# EasyEDA Pro project trumpx-ipadrescreen-ipad34-c6ab9950.epro, board PCB_A
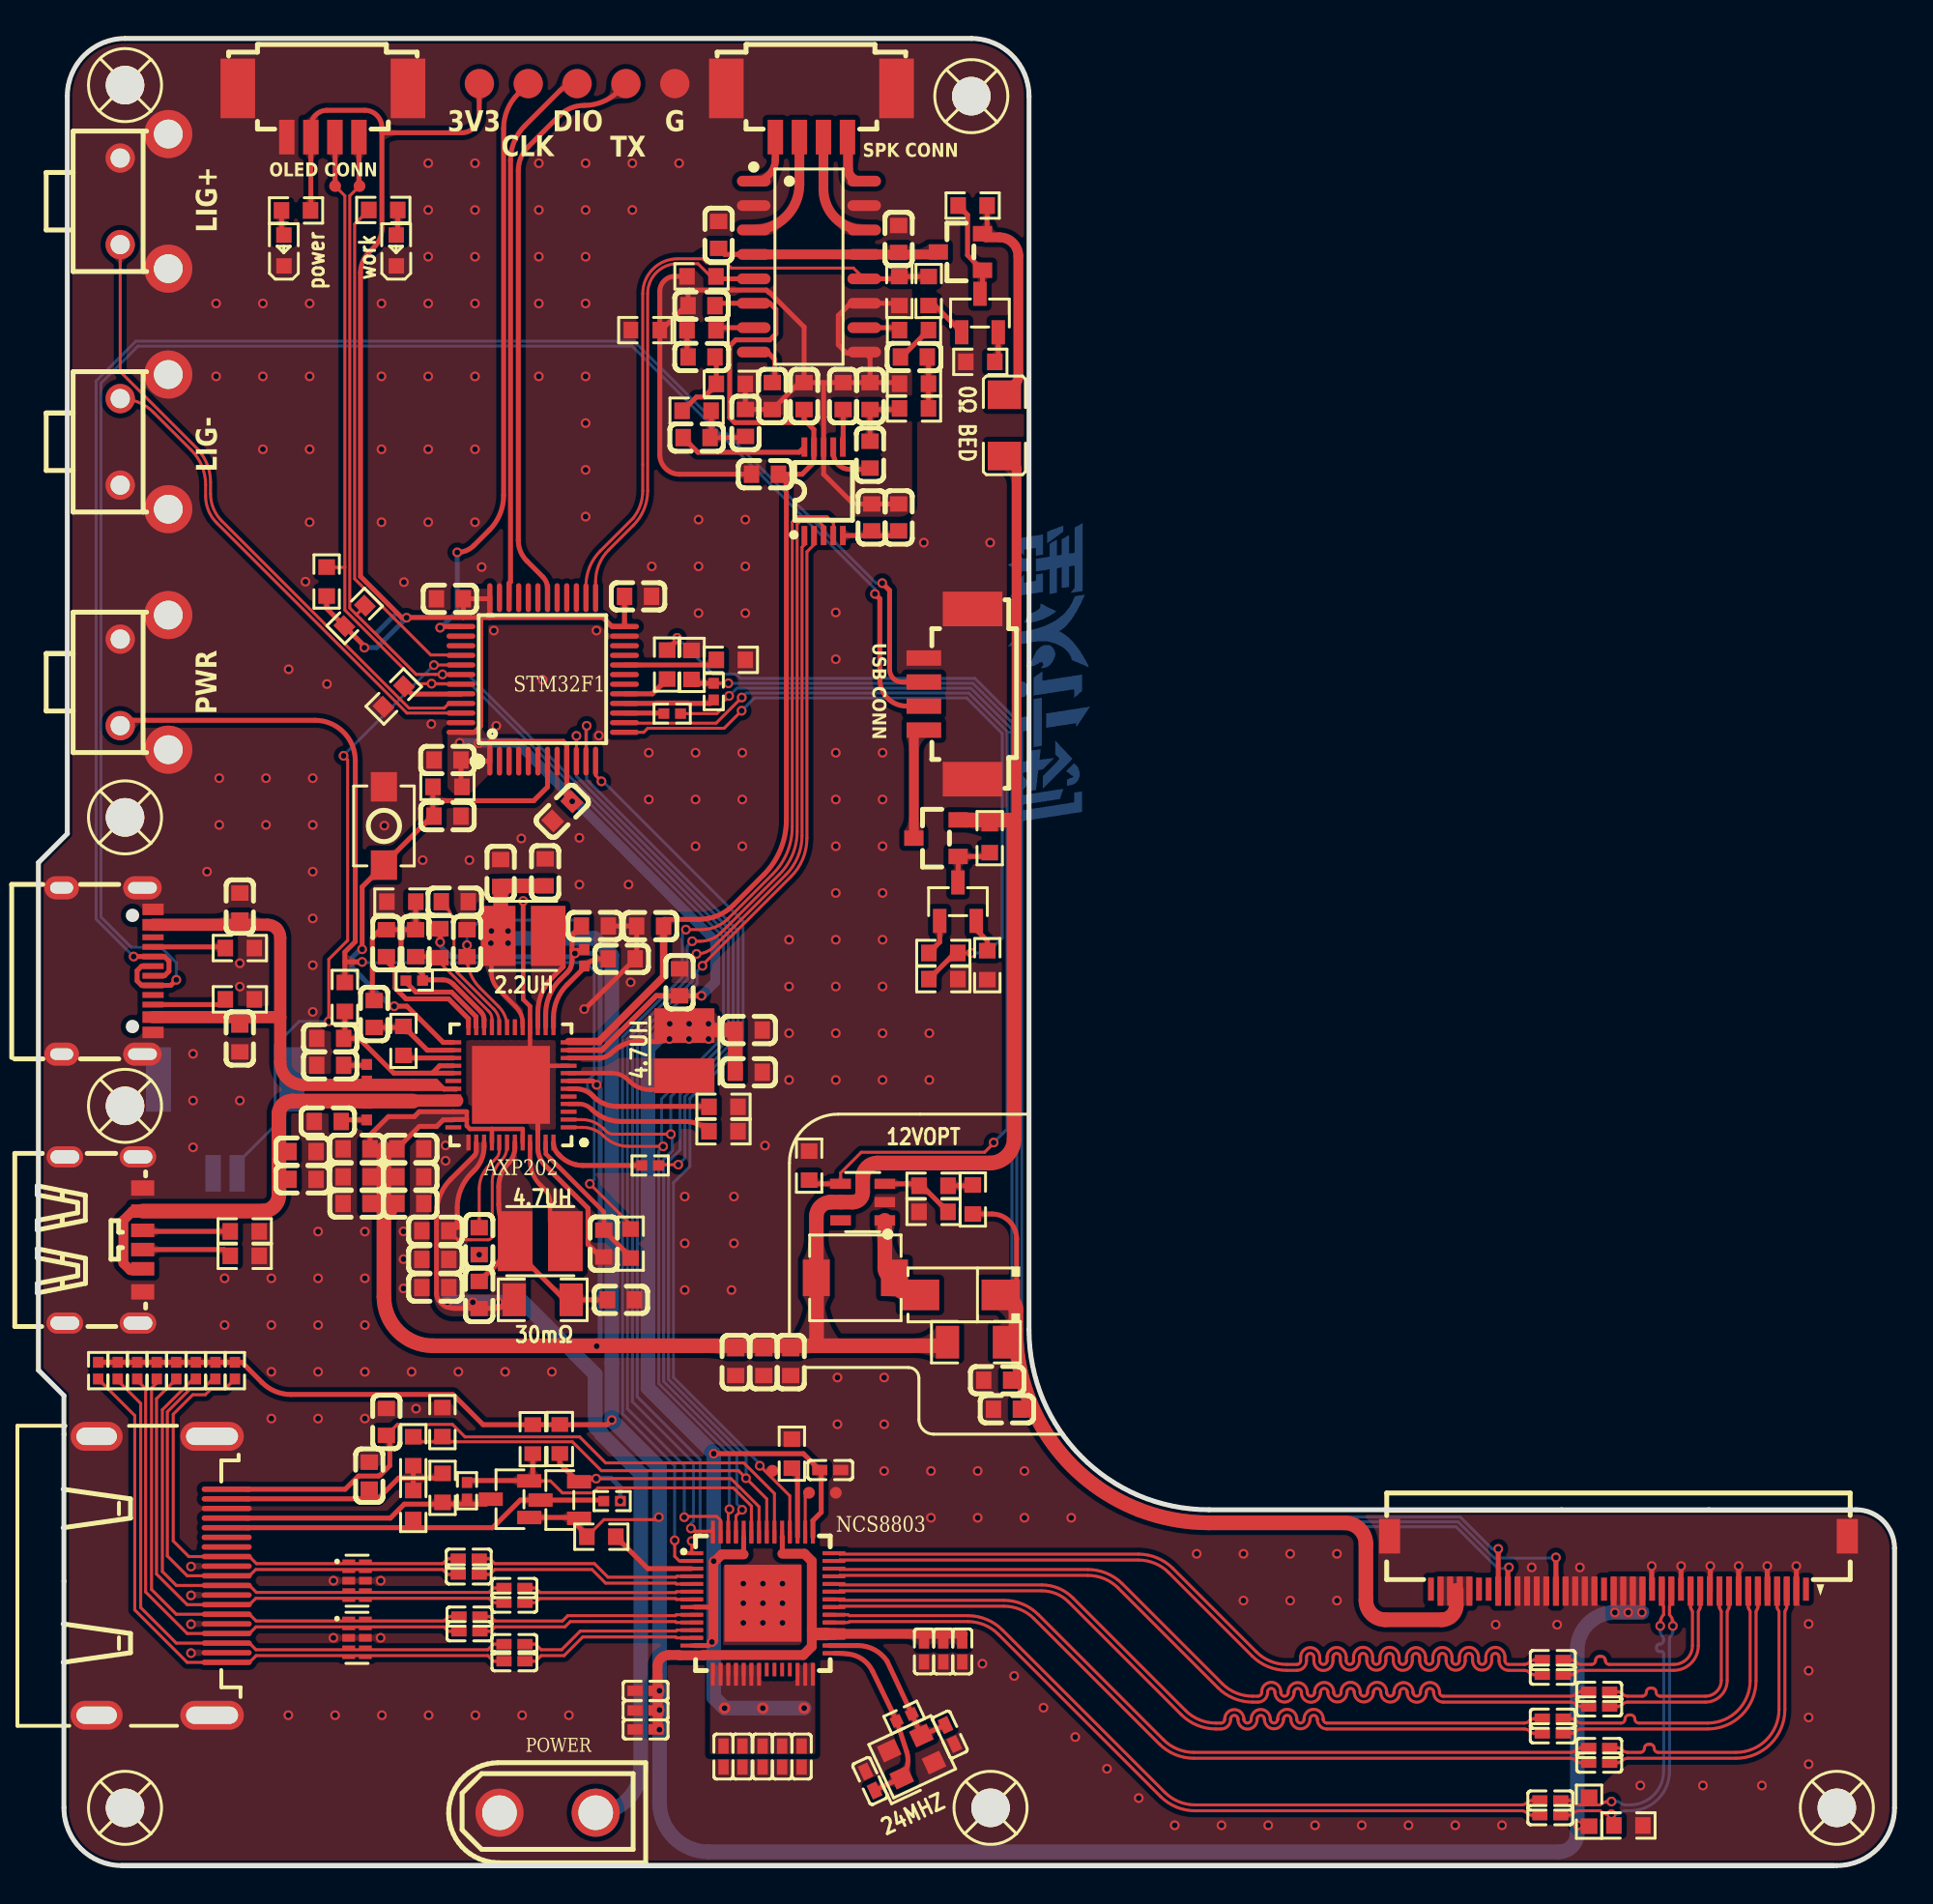
[diagram p6: board, top side]
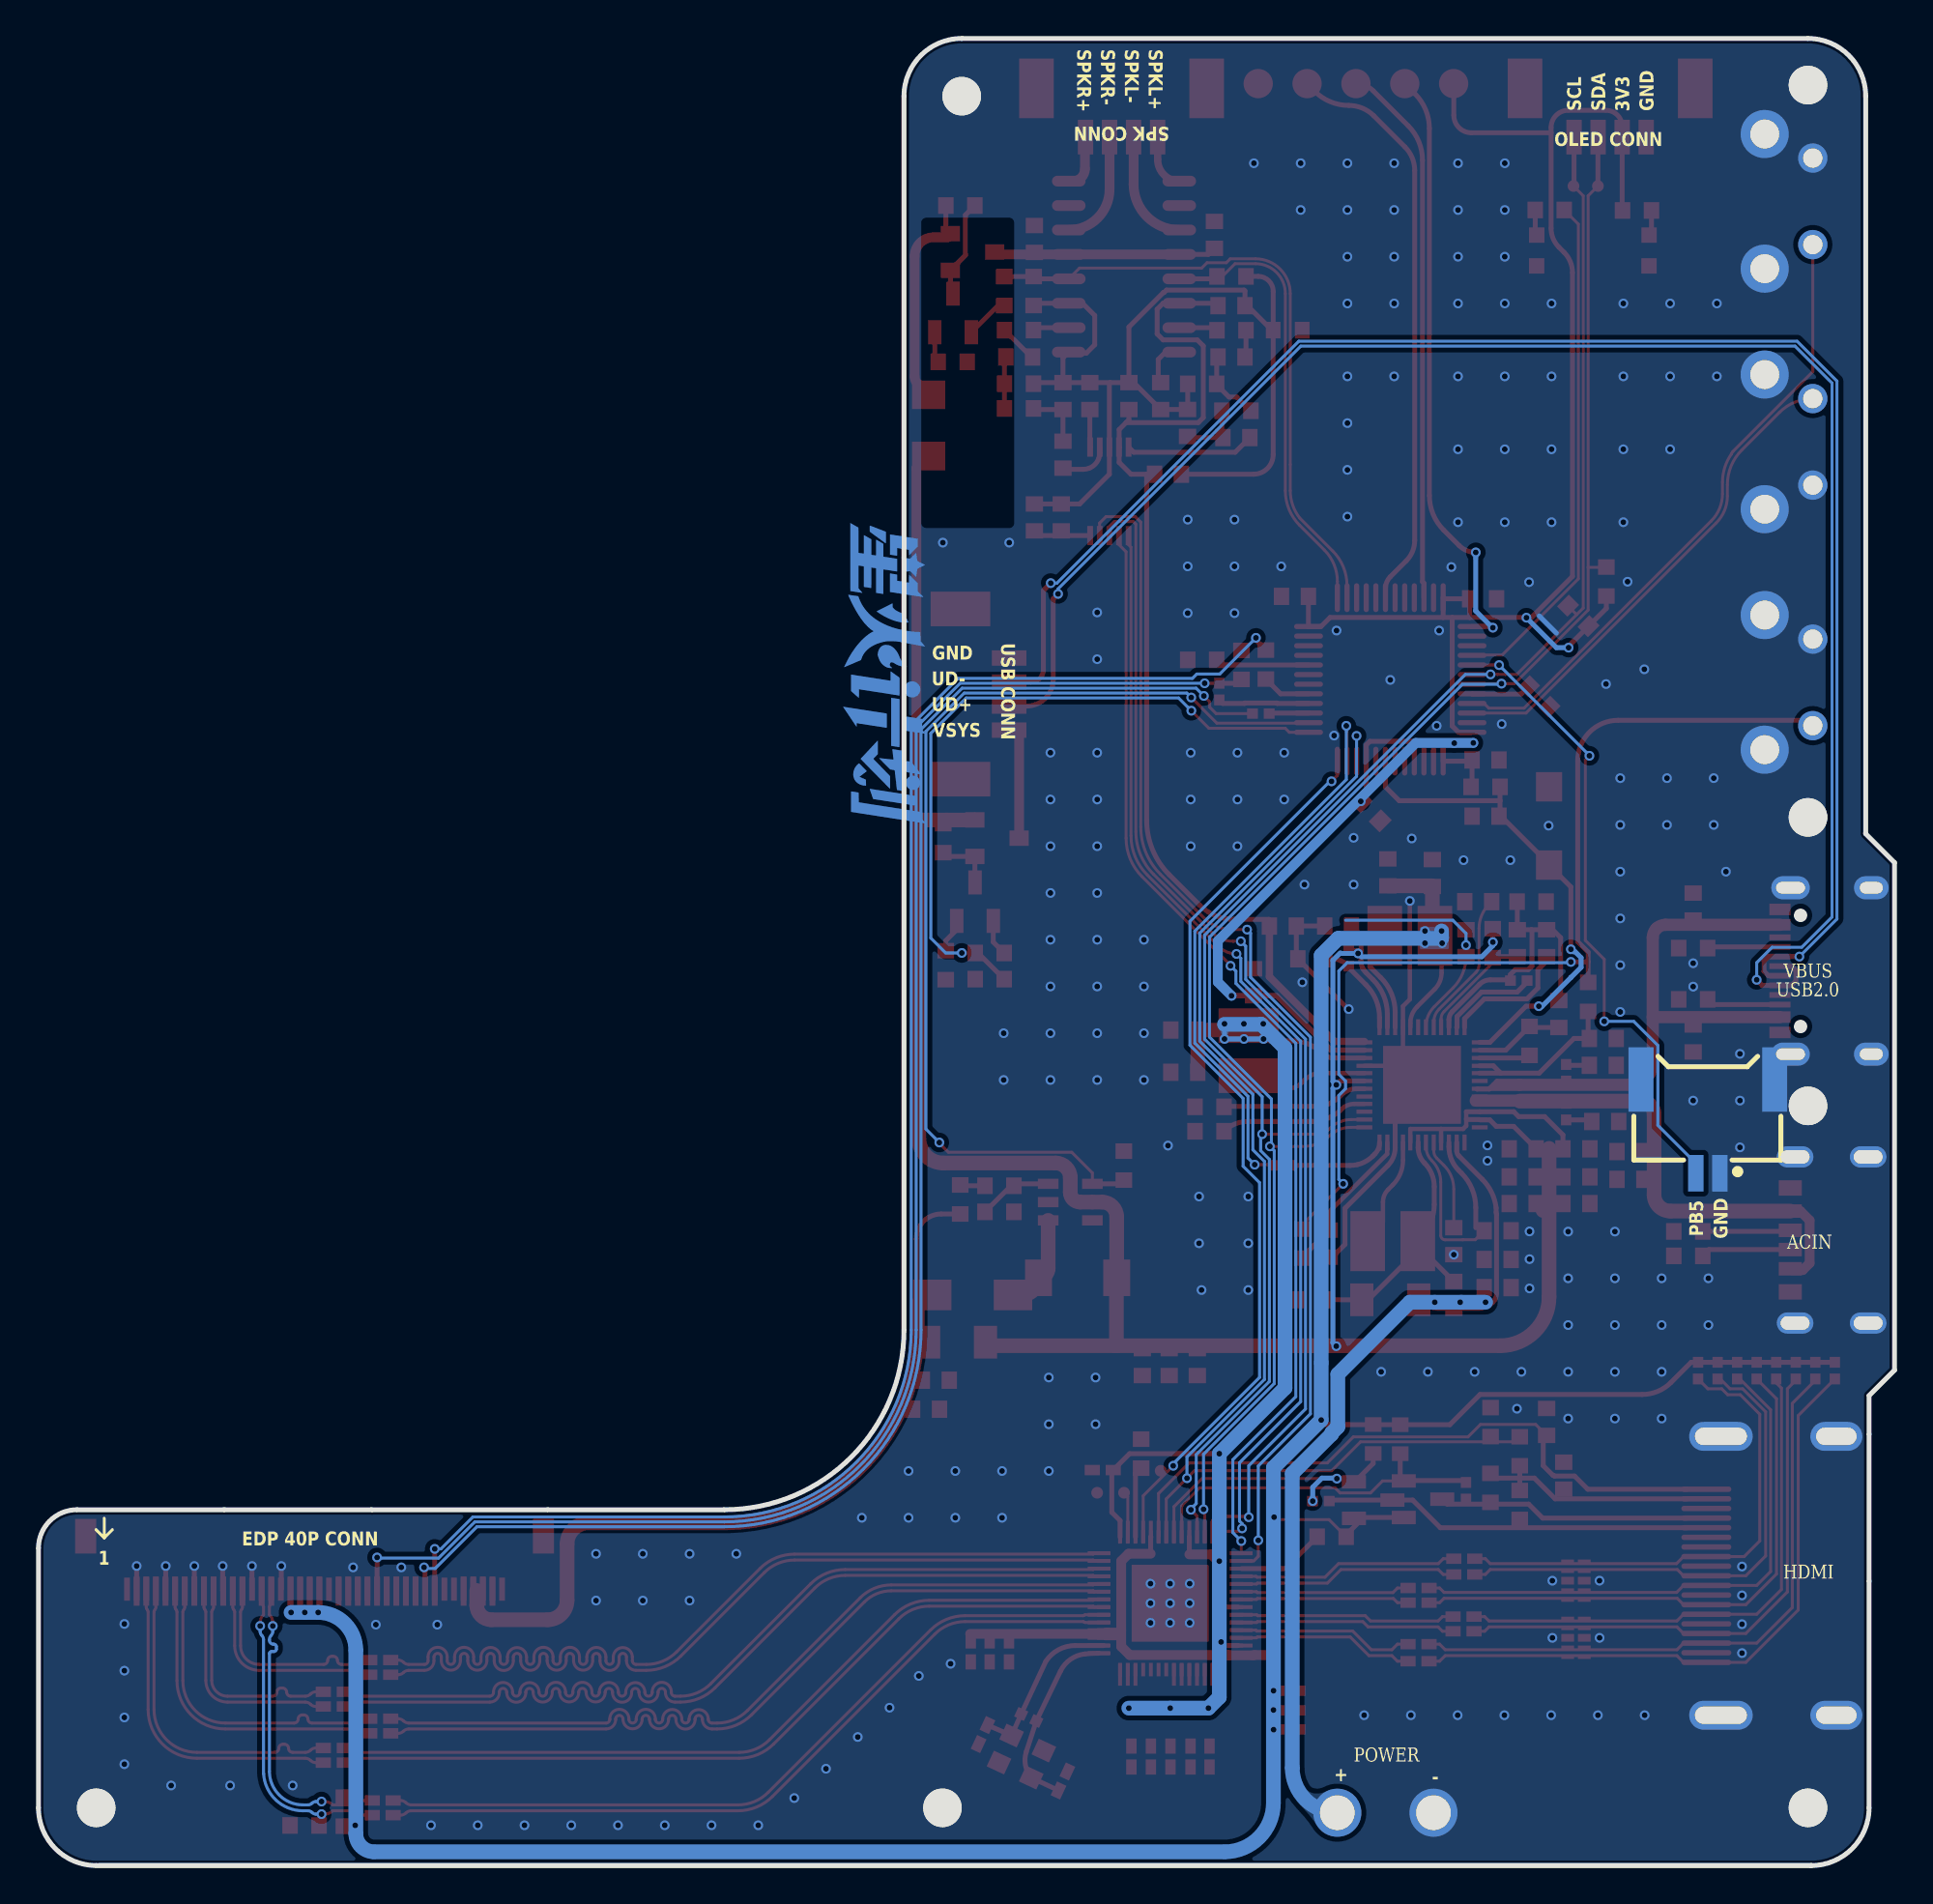
[diagram p7: board, bottom side, seen from below]

Outline 96.5 x 95 mm; copper layers: Top Layer, Inner1, Inner2, Bottom Layer. Coordinates in mm from the lower left corner of the outline.
Outline path: 4.32,0 arc(2.2,0.88) 1.32,3 1.32,24.43 0,25.76 0,52.15 1.5,53.65 1.5,92 arc(2.38,94.12) 4.5,95 48.5,95 arc(50.62,94.12) 51.5,92 51.5,27.85 arc(54.24,21.24) 60.85,18.5 94.5,18.5 arc(95.91,17.91) 96.5,16.5 96.5,3 arc(95.62,0.88) 93.5,0 4.32,0 ; 4.32,0 93.33,0 ; 79.18,18.49 arc(79.18,18.5) 79.18,18.5
Stack: Top Layer 0.035mm 外层铜厚1oz / Dielectric1 0.2104mm 7628 RC49% 8.6mil / Inner1 0.0152mm 内层铜厚 / Dielectric2 1.065mm 1.1mm H/HOZ Copper / Inner2 0.0152mm 内层铜厚 / Dielectric3 0.2104mm 7628 RC49% 8.6mil / Bottom Layer 0.035mm 外层铜厚1oz

## Design rules (mm)
net TMDS_CK_N: DP4
net HSICN: DP5
net TMDS_CK_P: DP4
net HSICP: DP5
net TMDS_D0_N: DP3
net HSI0N: DP6
net TMDS_D0_P: DP3
net HSI0P: DP6
net TMDS_D1_N: DP1
net HSI1N: DP7
net TMDS_D1_P: DP1
net HSI1P: DP7
net TMDS_D2_N: DP2
net HSI2N: DP8
net TMDS_D2_P: DP2
net HSI2P: DP8
net DPOAUX_N: DP13
net DP_AUX_N: DP19
net DPOAUX_P: DP13
net DP_AUX_P: DP19
net DPO0_N: DP9
net DP_LANE0_N: DP15
net DPO0_P: DP9
net DP_LANE0_P: DP15
net DPO1_N: DP10
net DP_LANE1_N: DP16
net DPO1_P: DP10
net DP_LANE1_P: DP16
net DPO2_N: DP11
net DP_LANE2_N: DP17
net DPO2_P: DP11
net DP_LANE2_P: DP17
net DPO3_N: DP12
net DP_LANE3_N: DP18
net DPO3_P: DP12
net DP_LANE3_P: DP18
net HDMI_DDC_SCL: DP14
net HDMI_DDC_SDA: DP14
spacing copperThickness1oz (default): track to track 0.102, other pairs 0.152 to 0.3
spacing copperThickness2oz: track to track 0.203, other pairs 0.152 to 0.3
spacing Plane_innerPlane: track to track 0.102, other pairs 0.152 to 0.3
spacing Copper_copperRegion: track to track 0.102, other pairs 0.152 to 0.3
track width copperThickness1oz (default): min 0.127, default 0.254, max 2.54
track width copperThickness2oz: min 0.203, default 0.254, max 2.54
differential pair differentialPair (default): width min 0.127, default 0.254, max 2.54; gap min 0.152, default 0.152
pour e2129 uses Copper_copperRegion
pour e2131 uses Copper_copperRegion
pour e2146 uses Copper_copperRegion
pour e2148 uses Copper_copperRegion
pour e2150 uses Copper_copperRegion
pour e2152 uses Copper_copperRegion
pour e2154 uses Copper_copperRegion
pour e2156 uses Copper_copperRegion
pour e2158 uses Copper_copperRegion
pour e2160 uses Copper_copperRegion
pour e2162 uses Copper_copperRegion
pour e2164 uses Copper_copperRegion
pour e2167 uses Copper_copperRegion
pour e2169 uses Copper_copperRegion
pour e2171 uses Copper_copperRegion
pour e2173 uses Copper_copperRegion
pour e2175 uses Copper_copperRegion
pour e2177 uses Copper_copperRegion
pour e2182 uses Copper_copperRegion
pour e2184 uses Copper_copperRegion

## Placement (name value [footprint] x y rotation side)
BEAD1  CBM321609U000T  [L1206]  50.22 74.88 270 top
C1  100nF  [C0402]  78.6 3.38 180 top
C2  100nF  [C0402]  22.37 15.95 180 top
C3  100nF  [C0402]  78.6 2.62 180 top
C4  100nF  [C0402]  22.37 15.14 180 top
C5  100nF  [C0402]  24.75 14.43 180 top
C6  100nF  [C0402]  24.75 13.67 180 top
C7  100nF  [C0402]  78.73 9.92 180 top
C8  100nF  [C0402]  22.41 12.94 180 top
C9  100nF  [C0402]  78.73 10.68 180 top
C10  100nF  [C0402]  22.41 12.18 180 top
C11  100nF  [C0402]  81.14 8.27 180 top
C12  100nF  [C0402]  24.75 11.51 180 top
C13  100nF  [C0402]  81.14 9.03 180 top
C14  100nF  [C0402]  24.75 10.62 180 top
C15  100nF  [C0402]  78.73 6.87 180 top
C16  1uF  [C0603]  17.2 20.27 90 top
C17  100nF  [C0402]  78.73 7.64 180 top
C18  1uF  [C0603]  18.09 23.07 270 top
C19  100nF  [C0402]  81.14 5.35 180 top
C20  100nF  [C0402]  81.14 6.11 180 top
C21  18PF  [C0402_NEW]  43.23 4.4 115 top
C22  18PF  [C0402_NEW]  47.39 6.81 295 top
C23  100nF  [C0402]  37.65 5.67 270 top
C24  10nF  [C0402]  36.6 5.67 270 top
C25  100nF  [C0402]  41.17 20.56 0 top
C26  10nF  [C0402]  39.68 5.67 270 top
C27  100nF  [C0402]  31.56 7.08 180 top
C28  10nF  [C0402]  47.05 11.13 270 top
C29  100nF  [C0603]  27.23 54.82 45 top
C30  100nF  [C0603]  21.26 57.48 0 top
C31  100nF  [C0603]  21.39 65.87 0 top
C32  100nF  [C0603]  31.17 65.99 180 top
C33  100nF  [C0402]  38.66 5.67 270 top
C34  10nF  [C0402]  35.61 5.67 270 top
C35  100nF  [C0402]  31.56 9.08 180 top
C36  10nF  [C0402]  31.56 8.07 180 top
C37  100nF  [C0402]  48.03 11.13 270 top
C38  10nF  [C0402]  46.04 11.13 270 top
C39  1uF  [C0603]  22.91 29.67 270 top
C40  10uF  [C0603]  20.63 31.51 0 top
C41  10uF  [C0603]  16.54 35.81 0 top
C42  10uF  [C0603]  30.28 29.42 0 top
C43  220nF  [C0603]  19.33 37.26 180 top
C44  10uF  [C0603]  16.54 34.42 180 top
C45  4.7uF  [C0603]  15.04 38.69 0 top
C46  1nF  [C0603]  36.93 43.44 0 top
C47  4.7uF  [C0603]  15.17 41.61 0 top
C48  10uF  [C0603]  36.93 41.25 0 top
C49  10uF  [C0603]  28.93 48.85 0 top
C50  1uF  [C0603]  17.45 44.28 270 top
C51  1nF  [C0603]  24.03 51.61 90 top
C52  10uF  [C0603]  26.34 51.64 90 top
C53  220nF  [C0603]  19.61 47.96 270 top
C54  4.7uF  [C0603]  36.25 26.18 270 top
C55  1uF  [C0603]  18.09 47.96 270 top
C56  4.7uF  [C0603]  16.54 37.26 180 top
C57  10uF  [C0603]  30.32 47.14 0 top
C58  4.7uF  [C0603]  22.28 47.96 270 top
C59  1uF  [C0603]  15.17 43.01 180 top
C60  4.7uF  [C0603]  31.8 48.85 180 top
C61  1uF  [C0603]  21.64 50.12 0 top
C62  4.7uF  [C0603]  22.91 32.46 270 top
C63  1uF  [C0603]  29.39 32.34 90 top
C64  4.7uF  [C0603]  33.33 45.93 90 top
C65  10uF  [C0603]  39.11 26.18 90 top
C66  100nF  [C0603]  37.71 26.18 90 top
C67  100nF  [C0603]  50.35 23.73 0 top
C68  10uF  [C0603]  49.85 25.24 0 top
C69  10uF  [C0603]  20.63 30.05 0 top
C70  100nF  [C0603]  20.63 33.01 0 top
C71  10uF  [C0603]  19.33 34.42 180 top
C72  100nF  [C0603]  19.33 35.81 180 top
C73  10uF  [C0603]  13.73 35.68 180 top
C74  100nF  [C0603]  13.73 37.12 180 top
C75  10uF  [C0603]  10.47 43.01 90 top
C76  100nF  [C0603]  10.47 49.86 270 top
C77  1uF  [C0603]  35.36 84.79 270 top
C78  1uF  [C0603]  44.72 84.57 90 top
C79  1uF  [C0603]  34.47 81.11 180 top
C80  10uF  [C0603]  37.77 72.34 180 top
C81  100nF  [C0603]  39.81 76.41 270 top
C82  3.3nF  [C0603]  43.23 76.41 90 top
C83  470nF  [c0603]  34.47 78.44 180 top
C84  470nF  [c0603]  45.51 78.44 180 top
C85  4.7uF  [C0603]  43.23 73.36 90 top
C86  100nF  [C0603]  38.15 76.41 90 top
C87  4.7uF  [C0603]  34.22 74.25 0 top
C88  10uF  [C0603]  43.32 70.1 270 top
C89  100nF  [C0603]  44.72 70.1 90 top
C90  10uF  [C0603]  41.84 76.41 270 top
C91  3.3nF  [C0603]  36.76 75.01 270 top
C92  100nF  [C0603]  21.26 54.56 180 top
CN1  XT30UPB-M  [CONN-TH_XT30UPB-M]  26.47 2.75 0 top
D1  SS34  [SMA_L4.3-W2.5-LS5.0-RD]  47.93 29.67 180 top
E1  RCLAMP0524P_C907837  [DFN2510-10_L2.5-W1.0-P0.50-BL]  16.56 11.84 270 top
E2  RCLAMP0524P_C907837  [DFN2510-10_L2.5-W1.0-P0.50-BL]  16.56 14.81 270 top
FPC1  X05A15L40T  [FFC-SMD_40P-P0.50_XKB_X05A15L40T]  82.15 15.75 180 top
FPC2  1.25-4PWB  [CONN-SMD_1.25-4PWB]  40.19 91.14 180 top
FPC3  1.25-4PWB  [CONN-SMD_1.25-4PWB]  47.3 60.91 90 top
FPC4  1.25-4PWB  [CONN-SMD_1.25-4PWB]  14.79 91.14 180 top
HDMI1  HDMI-SWM-19  [HDMI-SMD_19P-P0.50-H-F]  6.4 15.06 270 top
L1  4.7uH  [IND-SMD_L3.5-W3.0]  26.09 32.46 0 top
L2  4.7uH  [IND-SMD_L3.5-W3.0]  33.58 42.37 270 top
L3  2.2uH  [IND-SMD_L3.5-W3.0]  25.2 48.34 0 top
L4  22uH  [IND-SMD_L4.6-W4.2_SMMS0420]  42.47 30.56 180 top
LED1  -  [LED_0603]  12.75 84.03 90 top
LED2  -  [LED_0603]  18.6 84.03 90 top
NOREF  -  [Pad_e389]  41.38 15.04 270 top
NOREF#2  -  [Pad_e403]  39.46 9.92 180 top
NOREF#3  -  [Pad_e395]  41.38 12.64 270 top
NOREF#4  -  [Pad_e405]  40.27 9.92 180 top
NOREF#5  -  [Pad_e365]  33.95 12.64 90 top
NOREF#6  -  [Pad_e367]  33.95 11.84 90 top
NOREF#7  -  [Pad_e352]  88.4 14.27 180 top
NOREF#8  -  [Pad_e354]  90.4 14.27 180 top
NOREF#9  -  [Pad_e323]  40.06 19.38 0 top
NOREF#10  -  [Pad_e381]  39.46 17.35 0 top
NOREF#11  -  [Pad_e406]  36.27 9.92 180 top
NOREF#12  -  [Pad_e402]  37.46 9.92 180 top
NOREF#13  -  [Pad_e327]  74.4 14.27 180 top
NOREF#14  -  [Pad_e377]  37.86 17.35 0 top
NOREF#15  -  [Pad_e398]  35.46 9.92 180 top
NOREF#16  -  [Pad_e358]  33.95 15.84 90 top
NOREF#17  -  [Pad_e399]  35.86 9.92 180 top
NOREF#18  -  [Pad_e322]  38.15 20.53 0 top
NOREF#19  -  [Pad_e412]  25.46 92.65 180 top
NOREF#20  -  [Pad_e333]  78.4 14.27 180 top
NOREF#21  -  [Pad_e342]  83.4 14.27 180 top
NOREF#22  -  [Pad_e362]  33.95 14.24 90 top
NOREF#23  -  [Pad_e413]  22.92 92.65 180 top
NOREF#24  -  [Pad_e341]  82.9 14.27 180 top
NOREF#25  -  [Pad_e411]  28 92.65 180 top
NOREF#26  -  [Pad_e373]  36.26 17.35 0 top
NOREF#27  -  [Pad_e383]  33.95 13.44 90 top
NOREF#28  -  [Pad_e345]  85.9 14.27 180 top
NOREF#29  -  [Pad_e386]  41.38 12.24 270 top
NOREF#30  -  [Pad_e336]  79.9 14.27 180 top
NOREF#31  -  [Pad_e387]  41.38 15.84 270 top
NOREF#32  -  [Pad_e401]  37.06 9.92 180 top
NOREF#33  -  [Pad_e407]  40.26 17.35 0 top
NOREF#34  -  [Pad_e400]  36.67 9.92 180 top
NOREF#35  -  [Pad_e331]  77.4 14.27 180 top
NOREF#36  -  [Pad_e409]  33.08 92.65 180 top
NOREF#37  -  [Pad_e355]  90.9 14.27 180 top
NOREF#38  -  [Pad_e376]  37.46 17.35 0 top
NOREF#39  -  [Pad_e380]  39.06 17.35 0 top
NOREF#40  -  [Pad_e370]  41.38 16.24 270 top
NOREF#41  -  [Pad_e332]  77.9 14.27 180 top
NOREF#42  -  [Pad_e347]  87.4 14.27 180 top
NOREF#43  -  [Pad_e348]  87.9 14.27 180 top
NOREF#44  -  [Pad_e410]  30.54 92.65 180 top
NOREF#45  -  [Pad_e391]  41.38 14.24 270 top
NOREF#46  -  [Pad_e320]  15.42 87.33 0 top
NOREF#47  -  [Pad_e349]  88.9 14.27 180 top
NOREF#48  -  [Pad_e357]  33.95 16.24 90 top
NOREF#49  -  [Pad_e408]  33.95 11.04 90 top
NOREF#50  -  [Pad_e325]  73.4 14.27 180 top
NOREF#51  -  [Pad_e339]  81.9 14.27 180 top
NOREF#52  -  [Pad_e343]  84.4 14.27 180 top
NOREF#53  -  [Pad_e363]  33.95 13.84 90 top
NOREF#54  -  [Pad_e319]  41.46 19.38 0 top
NOREF#55  -  [Pad_e324]  72.9 14.27 180 top
NOREF#56  -  [Pad_e344]  84.9 14.27 180 top
NOREF#57  -  [Pad_e356]  91.4 14.27 180 top
NOREF#58  -  [Pad_e369]  35.06 9.92 180 top
NOREF#59  -  [Pad_e384]  33.95 11.44 90 top
NOREF#60  -  [Pad_e364]  33.95 13.04 90 top
NOREF#61  -  [Pad_e326]  73.9 14.27 180 top
NOREF#62  -  [Pad_e374]  36.66 17.35 0 top
NOREF#63  -  [Pad_e371]  35.46 17.35 0 top
NOREF#64  -  [Pad_e346]  86.4 14.27 180 top
NOREF#65  -  [Pad_e396]  41.38 11.44 270 top
NOREF#66  -  [Pad_e388]  41.38 15.44 270 top
NOREF#67  -  [Pad_e382]  39.86 17.35 0 top
NOREF#68  -  [Pad_e392]  41.38 13.84 270 top
NOREF#69  -  [Pad_e330]  76.9 14.27 180 top
NOREF#70  -  [Pad_e375]  37.06 17.35 0 top
NOREF#71  -  [Pad_e368]  35.06 17.35 0 top
NOREF#72  -  [Pad_e397]  41.38 11.04 270 top
NOREF#73  -  [Pad_e334]  78.9 14.27 180 top
NOREF#74  -  [Pad_e366]  33.95 12.24 90 top
NOREF#75  -  [Pad_e404]  39.86 9.92 180 top
NOREF#76  -  [Pad_e372]  35.86 17.35 0 top
NOREF#77  -  [Pad_e351]  89.9 14.27 180 top
NOREF#78  -  [Pad_e329]  76.4 14.27 180 top
NOREF#79  -  [Pad_e361]  33.95 14.64 90 top
NOREF#80  -  [Pad_e394]  41.38 13.04 270 top
NOREF#81  -  [Pad_e390]  41.38 14.64 270 top
NOREF#82  -  [Pad_e321]  16.69 87.33 0 top
NOREF#83  -  [Pad_e359]  33.95 15.44 90 top
NOREF#84  -  [Pad_e350]  89.4 14.27 180 top
NOREF#85  -  [Pad_e337]  80.4 14.27 180 top
NOREF#86  -  [Pad_e335]  79.4 14.27 180 top
NOREF#87  -  [Pad_e340]  82.4 14.27 180 top
NOREF#88  -  [Pad_e385]  41.38 11.84 270 top
NOREF#89  -  [Pad_e328]  75.9 14.27 180 top
NOREF#90  -  [Pad_e360]  33.95 15.04 90 top
NOREF#91  -  [Pad_e393]  41.38 13.44 270 top
NOREF#92  -  [Pad_e353]  86.9 14.27 180 top
NOREF#93  -  [Pad_e378]  38.26 17.35 0 top
NOREF#94  -  [Pad_e379]  38.66 17.35 0 top
NOREF#95  -  [Pad_e338]  80.9 14.27 180 top
Q1  2N7002  [SOT-23-3_L2.9-W1.3-P1.90-LS2.4-BR]  27.11 19 0 top
Q2  2N7002  [SOT-23-3_L2.9-W1.3-P1.90-LS2.4-BR]  24.52 19.05 0 top
Q3  AO3401A  [SOT-23_L2.9-W1.3-P1.90-LS2.4-BR]  47.93 83.9 0 top
Q4  SS8050  [SOT-23-3_L2.9-W1.3-P1.90-LS2.4-BR]  48.95 80.72 270 top
Q5  AO3401A  [SOT-23_L2.9-W1.3-P1.90-LS2.4-BR]  46.66 53.42 0 top
Q6  SS8050  [SOT-23-3_L2.9-W1.3-P1.90-LS2.4-BR]  47.81 50.12 270 top
R1  100kΩ  [R0603]  80.62 2.8 90 top
R3  4.7kΩ  [R0603]  39.17 21.41 90 top
R4  49.9Ω  [R0402]  3.1 25.73 90 top
R6  49.9Ω  [R0402]  4.12 25.73 90 top
R7  49.9Ω  [R0402]  5.13 25.73 90 top
R8  100kΩ  [R0603]  82.67 2.08 180 top
R9  49.9Ω  [R0402]  6.15 25.73 90 top
R10  49.9Ω  [R0402]  7.17 25.73 90 top
R11  49.9Ω  [R0402]  8.18 25.73 90 top
R12  49.9Ω  [R0402]  9.2 25.73 90 top
R13  4.7kΩ  [R0603]  29.27 17.1 180 top
R14  49.9Ω  [R0402]  10.21 25.73 90 top
R15  12kΩ  [R0603]  19.49 21.54 90 top
R16  10kΩ  [R0603]  21 23.06 270 top
R17  1M  [R0402]  45.01 7.7 205 top
R18  1kΩ  [R0603]  32.69 62.44 90 top
R19  49.9Ω  [R0402]  32.95 59.9 0 top
R20  49.9Ω  [R0402]  35.11 61.04 90 top
R21  10kΩ  [R0603]  33.96 62.43 270 top
R22  NC  [R0402]  29.82 18.95 0 top
R23  1kΩ  [R0603]  13.39 86.06 180 top
R24  1kΩ  [R0603]  17.93 86.08 0 top
R25  10kΩ  [R0603#2]  27.11 22.18 270 top
R26  10kΩ  [R0603]  19.49 18.75 270 top
R27  10kΩ  [R0603]  36 62.69 0 top
R28  10kΩ  [R0603#2]  18.47 60.79 225 top
R29  NC  [R0402]  22.28 19.49 90 top
R30  10kΩ  [R0603#2]  25.7 22.17 270 top
R31  10kΩ  [R0603]  21.01 19.64 270 top
R32  30mΩ  [R1206]  26.22 29.42 0 top
R33  2.2R  [R0402]  17.07 39.2 270 top
R34  2.2R  [R0402]  17.07 41.23 90 top
R35  200kΩ  [R0402]  19.54 46.01 180 top
R36  0Ω  [R0603]  20.89 47.96 270 top
R37  1R  [R0402]  28.38 47.2 270 top
R38  0Ω  [R0603]  18.87 50.12 0 top
R39  4.7kΩ  [R0603]  15.93 45.16 90 top
R40  1kΩ  [R0603]  30.79 32.34 270 top
R41  10kΩ  [R0603]  18.98 42.88 90 top
R42  0Ω  [R1206]  48.74 27.21 0 top
R43  10kΩ  [R0603]  48.58 34.63 270 top
R44  10kΩ  [R0603]  40.07 36.39 270 top
R45  10kΩ  [R0603]  46.54 35.34 0 top
R46  1kΩ  [R0603]  46.54 33.99 180 top
R47  49.9Ω  [R0402]  31.8 36.4 0 top
R48  10kΩ  [R0603]  35.61 39.45 180 top
R49  4.7kΩ  [R0603]  35.61 38.18 180 top
R52  10kΩ  [R0603]  45.52 77.05 180 top
R53  1kΩ  [R0603]  34.47 79.83 180 top
R54  1kΩ  [R0603]  45.52 79.84 180 top
R55  100kΩ  [R0603]  45.52 75.76 180 top
R56  100kΩ  [R0603]  34.22 75.64 180 top
R57  100kΩ  [R0603]  48.57 86.31 0 top
R58  10kΩ  [R0603]  36 77.04 180 top
R59  10kΩ  [R0603]  46.28 81.87 270 top
R60  10kΩ  [R0603]  34.47 82.63 0 top
R61  10kΩ  [R0603]  44.76 81.87 270 top
R62  1kΩ  [R0603]  48.97 78.18 0 top
R63  0Ω  [R0603#2]  31.55 79.84 180 top
R64  100kΩ  [R0603]  49.46 53.42 90 top
R65  10kΩ  [R0603]  47.05 47.45 180 top
R66  10kΩ  [R0603]  47.05 46.09 0 top
R67  1kΩ  [R0603]  49.33 46.81 90 top
R68  5.1kΩ  [R0603]  10.47 45.04 0 top
R69  10kΩ  [R0603]  21.26 56.09 0 top
R71  5.1kΩ  [R0603]  10.47 47.7 0 top
R72  5.1kΩ  [R0603]  10.72 31.7 0 top
R73  5.1kΩ  [R0603]  10.72 32.97 0 top
R74  4.7kΩ  [R0603#2]  16.44 64.98 45 top
R75  4.7kΩ  [R0603]  14.98 66.76 90 top
SCREW1  -  [M2螺丝]  93.5 3 0 top
SCREW2  -  [M2螺丝]  4.5 3 0 top
SCREW3  -  [M2螺丝]  4.5 39.5 0 top
SCREW4  -  [M2螺丝]  4.5 54.5 0 top
SCREW5  -  [M2螺丝]  48.5 92 0 top
SCREW6  -  [M2螺丝]  4.5 92.58 0 top
SCREW7  -  [M2螺丝]  49.5 3 0 top
SW1  TC-6615-5-260G  [SW-TH_4P-L7.5-W5.0-P4.50]  5.5 86.53 90 top
SW2  TC-6615-5-260G  [SW-TH_4P-L7.5-W5.0-P4.50]  5.5 74.03 90 top
SW3  TC-6615-5-260G  [SW-TH_4P-L7.5-W5.0-P4.50]  5.5 61.52 90 top
SW4  -  [Key_SMD_3x4x2]  17.96 54.05 270 top
U1  NCS8803  [QFN-56_L7.0-W7.0-P0.40-TL-EP5.2]  37.66 13.64 0 top
U2  STM32F103C8T6  [LQFP-48_L7.0-W7.0-P0.50-LS9.0-BL]  26.22 61.67 0 top
U3  -  [AXP202]  24.57 40.59 180 top
U4  MT3608  [SOT-23-6_L2.9-W1.6-P0.95-LS2.8-BL]  42.85 34.5 90 top
U5  PAM8403  [SOP-16_L10.0-W3.9-P1.27-LS6.0-BL]  40.06 83.14 270 top
U6  CS4344-CZZR  [TSSOP-10_L3.0-W3.0-P0.50-LS4.9-BL]  40.82 71.45 0 top
U7  XY-MX1.25-2A71  [CONN-SMD_2P-P1.25_XYECONN_XY-MX1.25-2A71]  9.71 38.43 0 bottom
USB1  TYPE-C 16PIN 2MD(073)  [USB-C-SMD_TYPE-C-6PIN-2MD-073]  3.58 46.52 270 top
USB2  TYPE-C 6P  [TYPE-C-SMD_TYPE-C-6P]  3.39 32.53 270 top
X1  24MHz  [CRYSTAL-SMD_4P-L2.5-W2.0-BL-A]  45.39 5.67 25 top

## Footprints (pads in the part's own frame, mm; a bottom-side part is the same pattern mirrored in y, then rotated)
AXP202
  rect 0.826x0.216 smd: 1(-2.997,2.21) 2(-2.997,1.804) 3(-2.997,1.397) 4(-2.997,0.991) 5(-2.997,0.61) 6(-2.997,0.203) 7(-2.997,-0.203) 8(-2.997,-0.61) 9(-2.997,-0.991) 10(-2.997,-1.397) 11(-2.997,-1.804) 12(-2.997,-2.21) 25(2.997,-2.21) 26(2.997,-1.804) 27(2.997,-1.397) 28(2.997,-0.991) 29(2.997,-0.61) 30(2.997,-0.203) 31(2.997,0.203) 32(2.997,0.61) 33(2.997,0.991) 34(2.997,1.397) 35(2.997,1.804) 36(2.997,2.21)
  rect 0.216x0.826 smd: 13(-2.21,-2.997) 14(-1.804,-2.997) 15(-1.397,-2.997) 16(-0.991,-2.997) 17(-0.61,-2.997) 18(-0.203,-2.997) 19(0.203,-2.997) 20(0.61,-2.997) 21(0.991,-2.997) 22(1.397,-2.997) 23(1.804,-2.997) 24(2.21,-2.997) 37(2.21,2.997) 38(1.804,2.997) 39(1.397,2.997) 40(0.991,2.997) 41(0.61,2.997) 42(0.203,2.997) 43(-0.203,2.997) 44(-0.61,2.997) 45(-0.991,2.997) 46(-1.397,2.997) 47(-1.804,2.997) 48(-2.21,2.997)
  rect 4.05x4.05 smd: 49(0,0)
C0402
  rect 0.79x0.54 smd: 1(-0.545,0) 2(0.545,0)
C0402_NEW
  rect 0.79x0.54 smd: 1(-0.545,0) 2(0.545,0)
C0603
  rect 0.8x0.9 smd: 1(-0.7,0) 2(0.7,0)
c0603
  rect 0.8x0.9 smd: 1(-0.7,0) 2(0.7,0)
CONN-SMD_1.25-4PWB
  rect 0.8x1.8 smd: 1(-1.875,1.266) 2(-0.625,1.266) 3(0.625,1.266) 4(1.875,1.266)
  rect 1.8x3.1 smd: 5(-4.425,-1.266) 6(4.425,-1.266)
CONN-SMD_2P-P1.25_XYECONN_XY-MX1.25-2A71
  rect 0.8x1.9 smd: 1(-0.625,2.438) 2(0.625,2.438)
  rect 1.3x3.35 smd: 3(3.475,-2.438) 4(-3.475,-2.438)
CONN-TH_XT30UPB-M
  round 2.5 hole 1.8: 1(-2.5,0) 2(2.5,0)
CRYSTAL-SMD_4P-L2.5-W2.0-BL-A
  rect 1x0.9 smd: 1(-0.925,-0.775) 2(0.925,-0.775) 3(0.925,0.775) 4(-0.925,0.775)
DFN2510-10_L2.5-W1.0-P0.50-BL
  rect 0.2x0.665 smd: 1(-1,-0.432) 2(-0.5,-0.432) 4(0.5,-0.432) 5(1,-0.432) 6(1,0.432) 7(0.5,0.432) 9(-0.5,0.432) 10(-1,0.433)
  rect 0.4x0.665 smd: 3(0,-0.433) 8(0,0.432)
FFC-SMD_40P-P0.50_XKB_X05A15L40T
  rect 0.3x1.2 smd: 1(-9.75,1.377) 2(-9.25,1.377) 3(-8.75,1.377) 4(-8.25,1.377) 5(-7.75,1.377) 6(-7.25,1.377) 7(-6.75,1.377) 8(-6.25,1.377) 9(-5.75,1.377) 10(-5.25,1.377) 11(-4.75,1.377) 12(-4.25,1.377) 13(-3.75,1.377) 14(-3.25,1.377) 15(-2.75,1.377) 16(-2.25,1.377) 17(-1.75,1.377) 18(-1.25,1.377) 19(-0.75,1.377) 20(-0.25,1.377) 21(0.25,1.377) 22(0.75,1.377) 23(1.25,1.377) 24(1.75,1.377) 25(2.25,1.377) 26(2.75,1.377) 27(3.25,1.377) 28(3.75,1.377) 29(4.25,1.377) 30(4.75,1.377) 31(5.25,1.377) 32(5.75,1.377) 33(6.25,1.377) 34(6.75,1.377) 35(7.25,1.377) 36(7.75,1.377) 37(8.25,1.377) 38(8.75,1.377) 39(9.25,1.377) 40(9.75,1.377)
  rect 1.1x1.8 smd: 41(11.9,-1.377) 42(-11.9,-1.377)
HDMI-SMD_19P-P0.50-H-F
  oval 0.28x2.6 smd: 1(4.501,3.38) 2(4,3.38) 3(3.5,3.38) 4(3,3.38) 5(2.499,3.38) 6(1.999,3.38) 7(1.501,3.38) 8(1.001,3.38) 9(0.5,3.38) 10(0,3.38) 11(-0.5,3.38) 12(-1,3.38) 13(-1.498,3.38) 14(-1.999,3.38) 15(-2.499,3.38) 16(-2.999,3.38) 17(-3.5,3.38) 18(-4,3.38) 19(-4.501,3.38)
  oval 1.5x2.7 hole 0.9x2.1: 20(7.25,-3.38) 21(-7.25,-3.38)
  oval 1.5x3.3 hole 0.9x2.7: 22(7.25,2.62) 23(-7.25,2.62)
IND-SMD_L3.5-W3.0
  rect 1.8x3.12 smd: 1(1.303,0) 2(-1.303,0)
IND-SMD_L4.6-W4.2_SMMS0420
  rect 1.4x1.9 smd: 1(2.032,0) 2(-2.032,0)
Key_SMD_3x4x2
  rect 1.53x1.36 smd: 1(-2.035,0) 2(2.035,0)
L1206
  rect 1.485x1.728 smd: 1(-1.593,0) 2(1.593,0)
LED_0603
  rect 0.8x0.8 smd: 1(-0.851,-0.01) 2(0.75,-0.005)
LQFP-48_L7.0-W7.0-P0.50-LS9.0-BL
  oval 0.27x1.5 smd: 1(-2.75,-4.25) 2(-2.25,-4.25) 3(-1.75,-4.25) 4(-1.25,-4.25) 5(-0.75,-4.25) 6(-0.25,-4.25) 7(0.25,-4.25) 8(0.75,-4.25) 9(1.25,-4.25) 10(1.75,-4.25) 11(2.25,-4.25) 12(2.75,-4.25) 25(2.75,4.25) 26(2.25,4.25) 27(1.75,4.25) 28(1.25,4.25) 29(0.75,4.25) 30(0.25,4.25) 31(-0.25,4.25) 32(-0.75,4.25) 33(-1.25,4.25) 34(-1.75,4.25) 35(-2.25,4.25) 36(-2.75,4.25)
  oval 1.5x0.27 smd: 13(4.25,-2.75) 14(4.25,-2.25) 15(4.25,-1.75) 16(4.25,-1.25) 17(4.25,-0.75) 18(4.25,-0.25) 19(4.25,0.25) 20(4.25,0.75) 21(4.25,1.25) 22(4.25,1.75) 23(4.25,2.25) 24(4.25,2.75) 37(-4.25,2.75) 38(-4.25,2.25) 39(-4.25,1.75) 40(-4.25,1.25) 41(-4.25,0.75) 42(-4.25,0.25) 43(-4.25,-0.25) 44(-4.25,-0.75) 45(-4.25,-1.25) 46(-4.25,-1.75) 47(-4.25,-2.25) 48(-4.25,-2.75)
M2螺丝
  round 2 hole 2: 1(0,0)
Pad_e319
  round 0.61 smd: TP1(0,0)
Pad_e320
  round 0.61 smd: TP2(0,0)
Pad_e321
  round 0.61 smd: TP3(0,0)
Pad_e322
  round 0.61 smd: TP4(0,0)
Pad_e323
  round 0.61 smd: TP5(0,0)
Pad_e324
  rect 0.305x1.524 smd: 1(0,0)
Pad_e325
  rect 0.305x1.524 smd: 1(0,0)
Pad_e326
  rect 0.305x1.524 smd: 1(0,0)
Pad_e327
  rect 0.305x1.524 smd: 1(0,0)
Pad_e328
  rect 0.305x1.524 smd: 1(0,0)
Pad_e329
  rect 0.305x1.524 smd: 1(0,0)
Pad_e330
  rect 0.305x1.524 smd: 1(0,0)
Pad_e331
  rect 0.305x1.524 smd: 1(0,0)
Pad_e332
  rect 0.305x1.524 smd: 1(0,0)
Pad_e333
  rect 0.305x1.524 smd: 1(0,0)
Pad_e334
  rect 0.305x1.524 smd: 1(0,0)
Pad_e335
  rect 0.305x1.524 smd: 1(0,0)
Pad_e336
  rect 0.305x1.524 smd: 1(0,0)
Pad_e337
  rect 0.305x1.524 smd: 1(0,0)
Pad_e338
  rect 0.305x1.524 smd: 1(0,0)
Pad_e339
  rect 0.305x1.524 smd: 1(0,0)
Pad_e340
  rect 0.305x1.524 smd: 1(0,0)
Pad_e341
  rect 0.305x1.524 smd: 1(0,0)
Pad_e342
  rect 0.305x1.524 smd: 1(0,0)
Pad_e343
  rect 0.305x1.524 smd: 1(0,0)
Pad_e344
  rect 0.305x1.524 smd: 1(0,0)
Pad_e345
  rect 0.305x1.524 smd: 1(0,0)
Pad_e346
  rect 0.305x1.524 smd: 1(0,0)
Pad_e347
  rect 0.305x1.524 smd: 1(0,0)
Pad_e348
  rect 0.305x1.524 smd: 1(0,0)
Pad_e349
  rect 0.305x1.524 smd: 1(0,0)
Pad_e350
  rect 0.305x1.524 smd: 1(0,0)
Pad_e351
  rect 0.305x1.524 smd: 1(0,0)
Pad_e352
  rect 0.305x1.524 smd: 1(0,0)
Pad_e353
  rect 0.305x1.524 smd: 1(0,0)
Pad_e354
  rect 0.305x1.524 smd: 1(0,0)
Pad_e355
  rect 0.305x1.524 smd: 1(0,0)
Pad_e356
  rect 0.305x1.524 smd: 1(0,0)
Pad_e357
  rect 0.203x1.143 smd: 1(0,0)
Pad_e358
  rect 0.203x1.143 smd: 1(0,0)
Pad_e359
  rect 0.203x1.143 smd: 1(0,0)
Pad_e360
  rect 0.203x1.143 smd: 1(0,0)
Pad_e361
  rect 0.203x1.143 smd: 1(0,0)
Pad_e362
  rect 0.203x1.143 smd: 1(0,0)
Pad_e363
  rect 0.203x1.143 smd: 1(0,0)
Pad_e364
  rect 0.203x1.143 smd: 1(0,0)
Pad_e365
  rect 0.203x1.143 smd: 1(0,0)
Pad_e366
  rect 0.203x1.143 smd: 1(0,0)
Pad_e367
  rect 0.203x1.143 smd: 1(0,0)
Pad_e368
  rect 0.203x1.143 smd: 1(0,0)
Pad_e369
  rect 0.203x1.143 smd: 1(0,0)
Pad_e370
  rect 0.203x1.143 smd: 1(0,0)
Pad_e371
  rect 0.203x1.143 smd: 1(0,0)
Pad_e372
  rect 0.203x1.143 smd: 1(0,0)
Pad_e373
  rect 0.203x1.143 smd: 1(0,0)
Pad_e374
  rect 0.203x1.143 smd: 1(0,0)
Pad_e375
  rect 0.203x1.143 smd: 1(0,0)
Pad_e376
  rect 0.203x1.143 smd: 1(0,0)
Pad_e377
  rect 0.203x1.143 smd: 1(0,0)
Pad_e378
  rect 0.203x1.143 smd: 1(0,0)
Pad_e379
  rect 0.203x1.143 smd: 1(0,0)
Pad_e380
  rect 0.203x1.143 smd: 1(0,0)
Pad_e381
  rect 0.203x1.143 smd: 1(0,0)
Pad_e382
  rect 0.203x1.143 smd: 1(0,0)
Pad_e383
  rect 0.203x1.143 smd: 1(0,0)
Pad_e384
  rect 0.203x1.143 smd: 1(0,0)
Pad_e385
  rect 0.203x1.143 smd: 1(0,0)
Pad_e386
  rect 0.203x1.143 smd: 1(0,0)
Pad_e387
  rect 0.203x1.143 smd: 1(0,0)
Pad_e388
  rect 0.203x1.143 smd: 1(0,0)
Pad_e389
  rect 0.203x1.143 smd: 1(0,0)
Pad_e390
  rect 0.203x1.143 smd: 1(0,0)
Pad_e391
  rect 0.203x1.143 smd: 1(0,0)
Pad_e392
  rect 0.203x1.143 smd: 1(0,0)
Pad_e393
  rect 0.203x1.143 smd: 1(0,0)
Pad_e394
  rect 0.203x1.143 smd: 1(0,0)
Pad_e395
  rect 0.203x1.143 smd: 1(0,0)
Pad_e396
  rect 0.203x1.143 smd: 1(0,0)
Pad_e397
  rect 0.203x1.143 smd: 1(0,0)
Pad_e398
  rect 0.203x1.143 smd: 1(0,0)
Pad_e399
  rect 0.203x1.143 smd: 1(0,0)
Pad_e400
  rect 0.203x1.143 smd: 1(0,0)
Pad_e401
  rect 0.203x1.143 smd: 1(0,0)
Pad_e402
  rect 0.203x1.143 smd: 1(0,0)
Pad_e403
  rect 0.203x1.143 smd: 1(0,0)
Pad_e404
  rect 0.203x1.143 smd: 1(0,0)
Pad_e405
  rect 0.203x1.143 smd: 1(0,0)
Pad_e406
  rect 0.203x1.143 smd: 1(0,0)
Pad_e407
  rect 0.203x1.143 smd: 1(0,0)
Pad_e408
  rect 0.203x1.143 smd: 1(0,0)
Pad_e409
  round 1.524 smd: TP1(0,0)
Pad_e410
  round 1.524 smd: TP1(0,0)
Pad_e411
  round 1.524 smd: TP1(0,0)
Pad_e412
  round 1.524 smd: TP1(0,0)
Pad_e413
  round 1.524 smd: TP1(0,0)
QFN-56_L7.0-W7.0-P0.40-TL-EP5.2
  rect 0.7x0.2 smd: 1(-3.45,2.6) 2(-3.45,2.2) 3(-3.45,1.8) 4(-3.45,1.4) 5(-3.45,1) 6(-3.45,0.6) 7(-3.45,0.2) 8(-3.45,-0.2) 9(-3.45,-0.6) 10(-3.45,-1) 11(-3.45,-1.4) 12(-3.45,-1.8) 13(-3.45,-2.2) 14(-3.45,-2.6) 29(3.45,-2.6) 30(3.45,-2.2) 31(3.45,-1.8) 32(3.45,-1.4) 33(3.45,-1) 34(3.45,-0.6) 35(3.45,-0.2) 36(3.45,0.2) 37(3.45,0.6) 38(3.45,1) 39(3.45,1.4) 40(3.45,1.8) 41(3.45,2.2) 42(3.45,2.6)
  rect 0.2x0.7 smd: 15(-2.6,-3.45) 16(-2.2,-3.45) 17(-1.8,-3.45) 18(-1.4,-3.45) 19(-1,-3.45) 20(-0.6,-3.45) 21(-0.2,-3.45) 22(0.2,-3.45) 23(0.6,-3.45) 24(1,-3.45) 25(1.4,-3.45) 26(1.8,-3.45) 27(2.2,-3.45) 28(2.6,-3.45) 43(2.6,3.45) 44(2.2,3.45) 45(1.8,3.45) 46(1.4,3.45) 47(1,3.45) 48(0.6,3.45) 49(0.2,3.45) 50(-0.2,3.45) 51(-0.6,3.45) 52(-1,3.45) 53(-1.4,3.45) 54(-1.8,3.45) 55(-2.2,3.45) 56(-2.6,3.45)
  rect 4x4 smd: 57(0.001,-0.001)
R0402
  rect 0.566x0.54 smd: 1(-0.432,0) 2(0.433,0)
R0603
  rect 0.806x0.864 smd: 1(-0.753,0) 2(0.753,0)
R0603#2
  rect 0.762x0.864 smd: 1(-0.753,0) 2(0.753,0)
R1206
  rect 1.208x1.701 smd: 1(-1.479,0) 2(1.479,0)
SMA_L4.3-W2.5-LS5.0-RD
  rect 2x1.593 smd: 1(-2.1,0) 2(2.1,0)
SOP-16_L10.0-W3.9-P1.27-LS6.0-BL
  oval 0.56x1.745 smd: 1(-4.445,-2.873) 2(-3.175,-2.873) 3(-1.905,-2.873) 4(-0.635,-2.873) 5(0.635,-2.873) 6(1.905,-2.873) 7(3.175,-2.873) 8(4.445,-2.873) 9(4.445,2.873) 10(3.175,2.873) 11(1.905,2.873) 12(0.635,2.873) 13(-0.635,2.873) 14(-1.905,2.873) 15(-3.175,2.873) 16(-4.445,2.873)
SOT-23-3_L2.9-W1.3-P1.90-LS2.4-BR
  rect 1.25x0.7 smd: 1(1,-0.95) 2(1,0.95) 3(-1,0)
SOT-23-6_L2.9-W1.6-P0.95-LS2.8-BL
  rect 0.532x1.072 smd: 1(-0.95,-1.149) 2(0,-1.149) 3(0.95,-1.149) 4(0.95,1.149) 5(0,1.149) 6(-0.95,1.149)
SOT-23_L2.9-W1.3-P1.90-LS2.4-BR
  rect 1x0.8 smd: 1(1.15,-0.95) 2(1.15,0.95) 3(-1.15,0)
SW-TH_4P-L7.5-W5.0-P4.50
  round 1.524 hole 1: 1(-2.25,1.25) 2(2.25,1.25)
  round 2.5 hole 1.5: 3(-3.5,-1.25) 4(3.5,-1.25)
TSSOP-10_L3.0-W3.0-P0.50-LS4.9-BL
  rect 0.299x1 smd: 1(-1,-2.3) 2(-0.5,-2.3) 3(0,-2.3) 4(0.5,-2.3) 5(1,-2.3) 6(1,2.3) 7(0.5,2.3) 8(0,2.3) 9(-0.5,2.3) 10(-1,2.3)
TYPE-C-SMD_TYPE-C-6P
  oval 1.1x1.9 hole 0.7x1.5: 7(-4.32,1.775) 7(-4.32,-2.025) 7(4.32,1.775) 7(4.32,-2.025)
  rect 0.7x1.2 smd: A5(-0.5,2.025) A9(1.5,2.025) B5(0.5,2.025) B9(-1.5,2.025)
  rect 0.8x1.2 smd: A12(2.7,2.025) B12(-2.7,2.025)
USB-C-SMD_TYPE-C-6PIN-2MD-073
  rect 0.6x1.1 smd: 1(-3.2,2.375) 2(-2.4,2.375) 11(2.4,2.375) 12(3.2,2.375)
  rect 0.3x1.1 smd: 3(-1.75,2.375) 4(-1.25,2.375) 5(-0.75,2.375) 6(-0.25,2.375) 7(0.25,2.375) 8(0.75,2.375) 9(1.25,2.375) 10(1.75,2.375)
  oval 1.2x2 hole 0.6x1.5: 13(-4.325,1.825) 14(4.325,1.825)
  oval 1.2x1.8 hole 0.6x1.2: 13(-4.325,-2.375) 14(4.325,-2.375)

## Nets
12V_EN: R44.2 U2.14 U4.4
AGND: C79.2 C80.2 C81.1 C82.2 C86.1 C88.1 C89.2 C90.1 C91.1 R52.2 R58.1 R60.1 R61.2 R63.1 U5.9 U5.11 U6.8
GND: C16.2 C18.1 C21.2 C22.2 C23.2 C24.2 C25.2 C26.2 C27.2 C28.2 C29.1 C30.1 C31.1 C32.1 C33.2 C34.2 C35.2 C36.2 C37.2 C38.2 C40.1 C41.1 C42.2 C43.1 C44.2 C45.1 C46.2 C47.1 C48.2 C49.2 C51.2 C52.2 C54.2 C56.2 C57.2 C58.1 C59.2 C60.2 C61.2 C62.2 C63.1 C64.2 C65.1 C66.1 C67.1 C68.1 C69.1 C70.1 C71.1 C72.1 C73.1 C74.1 C75.1 C76.1 C77.1 C78.2 C92.1 CN1.1 E1.3 E1.8 E2.3 E2.8 FPC1.2 FPC1.5 FPC1.8 FPC1.11 FPC1.14 FPC1.17 FPC1.23 FPC1.24 FPC1.25 FPC1.26 FPC1.28 FPC1.29 FPC1.30 FPC1.31 FPC1.41 FPC1.42 FPC2.5 FPC2.6 FPC3.4 FPC3.5 FPC3.6 FPC4.4 FPC4.5 FPC4.6 HDMI1.2 HDMI1.5 HDMI1.8 HDMI1.11 HDMI1.17 HDMI1.20 HDMI1.21 HDMI1.22 HDMI1.23 LED1.1 LED2.1 NOREF#7.1 NOREF#20.1 NOREF#30.1 NOREF#35.1 NOREF#36.TP1 NOREF#41.1 NOREF#54.TP1 NOREF#57.1 NOREF#69.1 NOREF#77.1 NOREF#85.1 NOREF#86.1 NOREF#92.1 NOREF#95.1 R3.2 R8.1 R16.1 R21.1 R27.2 R28.2 R38.1 R44.1 R46.2 R48.1 R49.1 R62.1 R63.2 R66.2 R67.1 R68.2 R71.2 R72.2 R73.2 SCREW1.1 SCREW2.1 SCREW3.1 SCREW4.1 SCREW5.1 SCREW6.1 SCREW7.1 SW1.2 SW1.3 SW1.4 SW2.1 SW2.3 SW2.4 SW3.2 SW3.3 SW3.4 SW4.1 U1.57 U2.8 U2.23 U2.35 U2.47 U3.9 U3.16 U3.37 U3.46 U3.49 U4.2 U5.2 U5.15 U7.1 U7.3 U7.4 USB1.1 USB1.12 USB1.13 USB1.14 USB2.7 USB2.A12 USB2.B12 X1.2 X1.4
VBAT: C39.2 C40.2 C69.2 C70.2 CN1.2 R32.1 U3.38 U3.39 U3.42
VBUS: C75.2 C76.2 R34.1 U3.31 USB1.2 USB1.11
VINT: C50.2 R41.2 U3.26
ACIN: C73.2 C74.2 R33.1 U3.32 U3.33 USB2.A9 USB2.B9
AUDIO_L: C83.1 R56.2 R58.2
AUDIO_R: C84.1 R52.1 R55.1
AXP_IRQ: R47.2 U2.11
AXP_PWRON: R39.2 R40.1 SW3.1
BL_VCC12: C67.2 C68.2 D1.1 FPC1.36 FPC1.37 FPC1.38 FPC1.39 NOREF#13.1 NOREF#50.1 NOREF#55.1 NOREF#61.1 R42.2 R43.2
BOOT0: R28.1 U2.44
BOOT1: R27.1 U2.20
DC3SET: C59.1 R39.1 U3.28 U3.29
DCDC2_1V2: C23.1 C24.1 C25.1 C26.1 C33.1 C34.1 C46.1 C48.1 L2.2 NOREF#2.1 NOREF#4.1 NOREF#11.1 NOREF#12.1 NOREF#15.1 NOREF#17.1 NOREF#27.1 NOREF#32.1 NOREF#33.1 NOREF#34.1 NOREF#58.1 NOREF#59.1 NOREF#62.1 NOREF#75.1 U1.8 U1.13 U1.15 U1.16 U1.17 U1.18 U1.19 U1.20 U1.21 U1.26 U1.27 U1.28 U1.43 U1.52 U3.10
DCDC3_3V3: C27.1 C28.1 C35.1 C36.1 C37.1 C38.1 C51.1 C52.1 FPC1.18 FPC1.19 FPC1.20 FPC1.21 L3.2 NOREF#21.1 NOREF#24.1 NOREF#29.1 NOREF#49.1 NOREF#51.1 NOREF#87.1 NOREF#88.1 NOREF#94.1 Q1.1 Q2.1 R1.1 R4.2 R6.2 R7.2 R9.2 R10.2 R11.2 R12.2 R13.2 R14.2 R25.1 R30.1 U1.14 U1.31 U1.32 U1.47 U3.17
DDCSCL: NOREF#38.1 Q1.2 R22.2 R25.2 U1.50
DDCSDA: NOREF#70.1 Q2.2 R29.2 R30.2 U1.51
DP_AUX_N: C1.1 FPC1.16 NOREF#52.1 R1.2
DP_AUX_P: C3.1 FPC1.15 NOREF#56.1 R8.2
DP_LANE0_N: C7.1 FPC1.12 NOREF#64.1
DP_LANE0_P: C9.1 FPC1.13 NOREF#28.1
DP_LANE1_N: C11.1 FPC1.9 NOREF#43.1
DP_LANE1_P: C13.1 FPC1.10 NOREF#42.1
DP_LANE2_N: C15.1 FPC1.6 NOREF#84.1
DP_LANE2_P: C17.1 FPC1.7 NOREF#47.1
DP_LANE3_N: C19.1 FPC1.3 NOREF#37.1
DP_LANE3_P: C20.1 FPC1.4 NOREF#8.1
DPO0_N: C7.2 NOREF#31.1 U1.41
DPO0_P: C9.2 NOREF#40.1 U1.42
DPO1_N: C11.2 NOREF.1 U1.39
DPO1_P: C13.2 NOREF#66.1 U1.40
DPO2_N: C15.2 NOREF#45.1 U1.37
DPO2_P: C17.2 NOREF#81.1 U1.38
DPO3_N: C19.2 NOREF#91.1 U1.35
DPO3_P: C20.2 NOREF#68.1 U1.36
DPOAUX_N: C1.2 NOREF#80.1 U1.34
DPOAUX_P: C3.2 NOREF#3.1 U1.33
EXTEN: C61.1 U3.20
HDMI_5V: C16.1 HDMI1.18 R15.1 R26.1 R31.1
HDMI_DDC_SCL: HDMI1.15 Q1.3 R22.1 R26.2
HDMI_DDC_SDA: HDMI1.16 Q2.3 R29.1 R31.2
HPD_IN: NOREF#14.1 R15.2 R16.2 U1.49 U2.10
HPD_OUT: C18.2 HDMI1.19 NOREF#93.1 U1.48
HSI0N: C5.1 NOREF#22.1 U1.6
HSI0P: C6.1 NOREF#53.1 U1.7
HSI1N: C8.1 NOREF#60.1 U1.9
HSI1P: C10.1 NOREF#5.1 U1.10
HSI2N: C12.1 NOREF#74.1 U1.11
HSI2P: C14.1 NOREF#6.1 U1.12
HSICN: C2.1 NOREF#90.1 U1.4
HSICP: C4.1 NOREF#79.1 U1.5
I2C_MASTER: NOREF#83.1 R13.1 U1.3
I2S_MCLK: NOREF#16.1 U1.2 U6.4
I2S_SCLK: NOREF#48.1 U1.1 U6.2
I2S_SD0: NOREF#71.1 U1.56 U6.1
I2S_WFS: NOREF#63.1 U1.55 U6.3
L_SPK+: FPC2.4 U5.1
L_SPK-: FPC2.3 U5.3
LDO2_3V3: C60.1 C79.1 C80.1 C81.2 U3.12 U5.6 U6.9
LDO3: C62.1 U3.41
LDO4_3V3: C29.2 C30.2 C31.2 C32.2 C64.1 FPC4.3 NOREF#23.TP1 R23.1 R69.2 R74.1 R75.1 U2.1 U2.9 U2.24 U2.36 U2.48 U3.11
N_OE: R49.2 U3.4
N_VBUSEN: R48.2 U3.6
NCS_RST: NOREF#18.TP4 NOREF#39.1 U1.46 U2.12
NCS_TEST: NOREF#9.TP5 NOREF#67.1 U1.44
PA8: U2.29
PA11: U2.32
PA12: U2.33
PA13/SWDIO: NOREF#25.TP1 U2.34
PA14/SWCLK: NOREF#19.TP1 U2.37
PA15: U2.38
PAGND: C50.1 C53.1 C55.1 R35.1 R38.2 U3.22
PAM_MUTE: R60.2 U2.25 U5.5
PAM_OFF: R59.1 R61.1 U2.26 U5.12
PB0: U2.18
PB1: U2.19
PB3: U2.39
PB4: R24.1 U2.40
PB10: U2.21
PB11: U2.22
PB14: U2.27
PB15: U2.28
PC13: U2.2
PC14: U2.3
PC15: U2.4
PD0: U2.5
PD1: U2.6
PMU_GPIO0: C58.2 U3.19
PMU_GPIO1: U3.18
PMU_GPIO2: U3.5
PMU_GPIO3: U3.3
PMU_IRQ: R47.1 U3.48
PMU_SCK: FPC4.1 NOREF#26.1 NOREF#82.TP3 R74.2 U1.53 U2.42 U3.2
PMU_SDA: FPC4.2 NOREF#46.TP2 NOREF#76.1 R75.2 U1.54 U2.43 U3.1
PWD: NOREF#10.1 R3.1 U1.45
PWREN: R41.1 U3.27
PWROK: C92.2 R69.1 SW4.2 U2.7 U3.25
R_SPK+: FPC2.1 U5.16
R_SPK-: FPC2.2 U5.14
SCR_EN: R19.1 U2.15
SCR_ENA: FPC1.32 NOREF#78.1 R19.2
SCR_HPD: R20.1 U2.16
SCR_HPDA: FPC1.27 NOREF#73.1 R20.2 R21.2
SCR_PWM: R18.1 U2.17
SCR_PWMA: FPC1.33 NOREF#89.1 R18.2
ST_LIGDN: SW2.2 U2.46
ST_LIGUP: SW1.1 U2.45
ST_U1_RX: U2.31
ST_U1_TX: NOREF#44.TP1 U2.30
TMDS_CK_N: C2.2 E2.1 E2.10 HDMI1.12 R14.1
TMDS_CK_P: C4.2 E2.2 E2.9 HDMI1.10 R12.1
TMDS_D0_N: C5.2 E2.4 E2.7 HDMI1.9 R11.1
TMDS_D0_P: C6.2 E2.5 E2.6 HDMI1.7 R10.1
TMDS_D1_N: C8.2 E1.1 E1.10 HDMI1.6 R9.1
TMDS_D1_P: C10.2 E1.2 E1.9 HDMI1.4 R7.1
TMDS_D2_N: C12.2 E1.4 E1.7 HDMI1.3 R6.1
TMDS_D2_P: C14.2 E1.5 E1.6 HDMI1.1 R4.1
USB_D+: FPC3.2 USB1.6 USB1.8
USB_D-: FPC3.3 USB1.5 USB1.7
USB_TP_CTL: U2.41 U7.2
USB_TP_ON: R65.1 R66.1 U2.13
VAMP: C77.2 C78.1 Q3.3 U5.4 U5.13
VSYS: BEAD1.2 C41.2 C43.2 C44.1 C49.1 C54.1 C56.1 C65.2 C66.2 C71.2 C72.2 L4.1 Q5.2 R36.1 R37.1 R42.1 R64.2 U3.7 U3.14 U3.34 U3.35 U3.40 U3.44 U4.5
VTPA: FPC3.1 Q5.3
XTALIN: C21.1 NOREF#72.1 R17.2 U1.29 X1.1
XTALOUT: C22.1 NOREF#65.1 R17.1 U1.30 X1.3
$1N2014: LED2.2 R24.2
$1N2019: LED1.2 R23.2
$2N2163: C57.1 R37.2 U3.13
$2N2176: L3.1 U3.15
$2N2192: C39.1 C42.1 L1.2 R32.2 U3.43
$2N2196: L2.1 U3.8
$2N2197: L1.1 U3.45
$2N2219: C53.2 R36.2 U3.21
$2N2222: R35.2 U3.23
$2N2223: C55.2 U3.24
$2N2239: C47.2 R34.2
$2N2245: C45.2 R33.2
$2N2267: C63.2 R40.2 U3.47
$2N6923: R45.1 R46.1 U4.3
$2N6925: R43.1 R45.2
$2N6929: D1.2 L4.2 U4.1
$3N1625: C90.2 U6.6
$3N1658: C88.2 C89.1 U6.5
$3N1681: R53.1 U5.7
$3N1683: C86.2 U5.8
$3N1684: C83.2 R53.2
$3N1688: Q4.2 R62.2
$3N1689: Q3.1 Q4.3 R57.1
$3N1690: Q4.1 R59.2
$3N1696: C84.2 R54.1
$3N1697: R54.2 U5.10
$3N3674: C87.2 C91.2 R56.1
$3N3678: C87.1 U6.10
$3N3684: C82.1 C85.2 R55.2
$3N3689: C85.1 U6.7
$3N4731: BEAD1.1 Q3.2 R57.2
$4N1203: R71.1 USB1.4
$4N1208: R68.1 USB1.10
$4N1222: R72.1 USB2.B5
$4N1223: R73.1 USB2.A5
$4N1594: Q6.2 R67.2
$4N1595: Q5.1 Q6.3 R64.1
$4N1603: Q6.1 R65.2

Pads without a net: FPC1 1 22 34 35 40; HDMI1 13 14; U1 22 23 24 25; U3 30 36; U4 6; USB1 3 9

## Via types
v1: diameter 0.505, hole 0.302, Top Layer to Bottom Layer, 314 vias
v2: diameter 0.61, hole 0.302, Top Layer to Bottom Layer, 3 vias
v3: diameter 0.5, hole 0.299, Top Layer to Bottom Layer, 1 via

## Routing (per net, layer and track width the routed paths; a pad name or vN(x,y) marks a point on that pad's centre or on a via; arc(x,y) is an arc through that point)
12V_EN: length 54
  Top Layer w0.152: v1(49.66,37.59) 49.66,37.56 49.19,37.09 42.78,37.09 41.7,36.01 U4.4 ; v1(36.57,60.73) 35.23,59.4 30.49,59.4 U2.14
  Top Layer w0.254: U4.4 40.26,35.45 arc(40.13,35.5) R44.2
  Bottom Layer w0.152: v1(36.57,60.73) 36.8,60.96 48.37,60.96 50.36,58.97 50.36,38.29 v1(49.66,37.59)
AGND: length 56
  Top Layer w0.254: C82.2 43.23,78.39 U5.9 42.88,78.64 42.02,78.64 41.58,79.07 41.58,80.6 42.22,81.23 U5.11 44.64,81.23 R61.2 ; C82.2 C90.1 40.78,77.11 ; C82.2 44.71,77.11 R52.2 ; 32.34,79.8 33.77,81.23 33.77,81.87 33.82,81.92 37.85,81.92 37.98,81.79 38.01,81.79 39.81,80 C81.1 ; C81.1 39.55,77.11 C86.1 38.15,75.71 36.5,75.71 36.75,75.95 R58.1 ; C81.1 40.78,77.11 ; R60.1 33.08,82.63 arc(32.53,82.4) 32.3,81.85 R63.1 32.3,73.37 arc(32.6,72.64) 33.33,72.34 C80.2 ; C89.2 C88.1 42.37,70.8 40.82,72.34 U6.8 40.82,77.06 40.78,77.11
GND: length 35.2
  Top Layer w0.229: v1(25.2,50.16) 25.2,45.04 25.56,44.68 U3.16 25.56,41.58 arc(25.27,40.88) U3.49 ; U3.9 26.6,41.58
  Top Layer w0.254: 25.96,38.56 U3.46 25.96,37.32 arc(26.06,36.82) 26.34,36.4 28.55,34.2 arc(28.56,34.18) 28.57,34.17 28.57,32.3 29.02,31.85 29.19,31.85 arc(29.28,31.79) 29.39,31.76 ; 91.4,15.57 FPC1.2 ; FPC1.14 85.4,14.38 v1(85.4,15.57) ; v1(28.38,44.53) 28.41,44.53 C57.2 arc(31.08,47.17) 31.1,47.22 31.1,48.85 arc(31.1,48.85) 31.1,48.85 C49.2 ; v1(83.87,15.57) 83.87,14.39 FPC1.17 ; v1(89.88,15.57) 89.88,14.38 FPC1.5 ; v1(86.92,15.57) 86.92,14.3 NOREF#92.1 ; 88.4,15.57 NOREF#7.1
  Bottom Layer w0.254: 17.58,64.09 18.47,64.98
  vias: v1(7.93,15.55) v1(7.93,14.05) v1(7.93,12.55) v1(7.93,11.05) v1(8.04,42.2) v1(8.04,39.77) v1(8.04,37.34) v1(8.76,51.68) v1(9.24,81.22) v1(9.24,77.43) v1(9.4,56.54) v1(9.4,54.11) v1(9.68,30.53) v1(9.68,28.1) v1(10.47,46.92) v1(10.47,45.7) v1(10.47,39.77) v1(11.67,81.22) v1(11.67,77.43) v1(11.67,73.64) v1(11.83,56.54) v1(11.83,54.11) v1(12.11,30.53) v1(12.11,28.1) v1(12.11,25.67) v1(12.11,23.24) v1(13.01,62.2) v1(12.99,7.82) v1(13.88,66.75) v1(14.1,81.22) v1(14.1,77.43) v1(14.1,73.64) v1(14.1,69.85) v1(14.26,56.54) v1(14.26,54.11) v1(14.26,51.68) v1(14.26,49.25) v1(14.26,46.82) v1(14.26,44.39) v1(14.54,32.96) v1(14.54,30.53) v1(14.54,28.1) v1(14.54,25.67) v1(14.54,23.24) v1(15,61.43) v1(15.33,11.84) v1(15.34,14.81) v1(15.42,7.82) v1(16.97,32.96) v1(16.97,30.53) v1(16.97,28.1) v1(16.97,25.67) v1(16.97,23.24) v1(17.83,81.22) v1(17.83,77.43) v1(17.83,73.64) v1(17.83,69.85) v1(17.79,14.81) v1(17.79,11.84) v1(17.85,7.82) v1(17.98,54.07) v1(19,66.73) v1(18.98,32.97) v1(18.98,31.53) v1(18.98,30.01) v1(19.4,25.67) v1(19.63,23.75) v1(19.98,52.28) v1(20.26,88.51) v1(20.26,86.08) v1(20.26,83.65) v1(20.26,81.22) v1(20.26,77.43) v1(20.26,73.64) v1(20.26,69.85) v1(20.28,7.82) v1(20.42,59.35) v1(21.17,37.44) v1(21.17,36.65) v1(21.83,25.67) v1(22.41,52.28) v1(22.69,88.51) v1(22.69,86.08) v1(22.69,83.65) v1(22.69,81.22) v1(22.69,77.43) v1(22.69,73.64) v1(22.69,69.85) v1(22.72,7.82) v1(22.91,31.76) v1(23.04,67.52) v1(23.68,64.21) v1(23.8,59.26) v1(24.26,25.67) v1(25.1,53.4) v1(25.15,7.82) v1(26.02,88.51) v1(26.02,86.08) v1(26.02,83.65) v1(26.02,81.22) v1(26.02,77.43) v1(26.22,61.65) v1(26.69,25.67) v1(27.58,7.82) v1(28.12,53.44) v1(28.12,51.01) v1(28.45,88.51) v1(28.45,86.08) v1(28.45,83.65) v1(28.45,81.22) v1(28.45,77.43) v1(28.45,75) v1(28.45,72.57) v1(28.45,70.14) v1(29.01,64.21) v1(29.14,58.75) v1(30.68,51.01) v1(30.79,45.93) v1(30.88,88.51) v1(30.88,86.08) v1(31.73,57.86) v1(31.73,55.43) v1(31.89,67.55) v1(33.31,88.51) v1(33.6,34.79) v1(33.6,32.36) v1(33.6,29.92) v1(34.16,57.86) v1(34.16,55.43) v1(34.16,53) v1(34.32,69.98) v1(34.32,67.55) v1(34.32,65.12) v1(36.03,29.92) v1(36.16,34.79) v1(36.16,32.36) v1(36.59,57.86) v1(36.59,55.43) v1(36.59,53) v1(36.65,14.66) v1(36.65,13.64) v1(36.65,12.62) v1(36.75,69.98) v1(36.75,67.55) v1(36.75,65.12) v1(37.67,14.66) v1(37.66,13.64) v1(37.66,12.62) v1(37.77,37.44) v1(38.68,14.66) v1(38.68,13.64) v1(38.68,12.62) v1(39.02,48.14) v1(39.02,45.71) v1(39.02,43.28) v1(39.02,40.85) v1(41.45,65.15) v1(41.45,62.72) v1(41.45,57.86) v1(41.45,55.43) v1(41.45,53) v1(41.45,50.57) v1(41.45,48.14) v1(41.45,45.71) v1(41.45,43.28) v1(41.45,40.85) v1(41.54,25.38) v1(41.54,22.94) v1(43.89,57.86) v1(43.89,55.43) v1(43.89,53) v1(43.89,50.57) v1(43.89,48.14) v1(43.89,45.71) v1(43.89,43.28) v1(43.89,40.85) v1(43.97,25.38) v1(43.97,22.94) v1(43.97,20.51) v1(46.03,68.79) v1(46.32,43.28) v1(46.32,40.85) v1(46.4,20.51) v1(46.4,18.08) v1(48.83,20.51) v1(48.83,18.08) v1(49.08,10.49) v1(49.48,68.79) v1(50.73,9.86) v1(51.26,20.51) v1(51.26,18.08) v1(52.25,8.21) v1(53.69,18.08) v1(53.9,6.68) v1(55.55,5.03) v1(57.2,3.51) v1(59.08,2.09) v1(60.22,16.21) v1(61.51,2.09) v1(62.65,16.21) v1(62.65,13.78) v1(63.94,2.09) v1(65.08,16.21) v1(65.08,13.78) v1(66.37,2.09) v1(67.51,16.21) v1(67.51,13.78) v1(68.8,2.09) v1(71.23,2.09) v1(73.66,2.09) v1(75.77,12.53) v1(76.09,2.09) v1(77.64,15.5) v1(78.96,12.53) v1(80.14,15.5) v1(83.28,4.16) v1(86.54,4.16) v1(88.39,15.57) v1(89.6,4.16) v1(91.39,15.57) v1(92.03,12.56) v1(92.03,10.13) v1(92.03,7.7) v1(92.03,5.27)
VBAT: length 59.9
  Top Layer w0.152: C70.2 21.8,32.54 22.42,32.54 arc(22.44,32.54) 22.46,32.54 23.36,32.54 arc(23.53,32.6) 23.59,32.76 23.59,35.53 arc(23.71,36.14) 24.06,36.66 arc(24.28,36.99) 24.36,37.39 U3.42
  Top Layer w0.254: U3.39 23.17,37.37 arc(23.04,36.71) 22.66,36.15 22.52,36 arc(21.97,35.18) 21.77,34.21 21.77,33.16 ; U3.38 22.76,37.15 arc(22.74,37.02) 22.66,36.91 21.44,35.69 arc(20.95,35) 20.71,34.2 20.71,33.97 arc(20.71,33.92) 20.69,33.87 20.69,29.75 arc(20.74,29.5) 20.88,29.29 arc(21.24,29.05) 21.65,28.97 C39.2 23.66,28.97 arc(24.24,29.09) R32.1
  Bottom Layer w0.762: v1(21.26,29.29) v1(23.9,29.29) 25.2,29.29 28.95,25.55 28.95,22.81 29.27,22.49 29.27,22.43 31.31,20.38 31.31,5.09 arc(30.63,3.43) CN1.2
  vias: v1(22.58,29.29)
VBUS: length 32.9
  Top Layer w0.254: 21.06,40.39 21.07,40.37 21.7,40.37 21.71,40.37 ; 21.06,40.39 20.67,40.78 19.49,40.78 ; 21.06,40.39 21.04,40.4 19.54,40.4 ; 20.84,40.59 19.48,40.59
  Top Layer w0.635: 12.57,44.12 12.57,48.25 arc(12.53,48.48) 12.4,48.69 arc(12.38,48.72) 12.34,48.75 arc(12.14,48.87) 11.91,48.92 USB1.2 ; 12.57,44.12 USB1.11 ; 12.57,44.12 12.57,41.78 arc(12.92,40.94) 13.75,40.59 19.48,40.59 19.49,40.59
VINT: length 4.5
  Top Layer w0.254: 17.58,43.58 18.92,43.58 R41.2 20.21,42.4 U3.26
ACIN: length 26
  Top Layer w0.508: USB2.B9 4.9,34.03 4.41,33.55 4.41,31.32 4.77,30.96 5.35,30.96 USB2.A9
  Top Layer w0.635: 21.77,39.77 19.51,39.77 19.49,39.75
  Top Layer w0.762: 19.49,39.75 13.18,39.75 arc(12.7,39.55) 12.5,39.07 12.5,34.88 arc(12.25,34.28) 11.65,34.03 USB2.B9
AUDIO_L: length 3.8
  Top Layer w0.254: 35.16,78.44 35.24,78.36 R58.2 35.24,77 34.6,76.36 34.21,76.36 33.5,75.64 R56.2
AUDIO_R: length 2.7
  Top Layer w0.254: C84.1 46.27,78.38 R52.1 R55.1
AXP_IRQ: length 30.3
  Top Layer w0.152: v1(28.5,59.26) 28.47,59.23 U2.11 ; R47.2 32.28,36.44 v1(33.27,36.44)
  Bottom Layer w0.152: v1(33.27,36.44) 33.61,36.79 33.61,40 36.38,42.76 36.38,48.59 28.5,56.46 v1(28.5,59.26)
AXP_PWRON: length 53
  Top Layer w0.152: 30.79,33.22 30.79,33.32 v1(28.67,35.45)
  Top Layer w0.254: SW3.1 4.53,59.55 14.37,59.55 arc(15.86,58.93) 16.47,57.45 16.47,48.04 15.93,47.5 15.93,46.98 ; R39.2 15.93,46.98 ; 15.93,46.98 v1(16.83,46.98)
  Bottom Layer w0.152: v1(16.83,46.98) 16.87,46.95 28.46,46.95 28.89,46.51 28.89,41.14 28.54,40.79 28.54,40.39 28.89,40.04 28.89,35.67 v1(28.67,35.45)
BL_VCC12: length 42.3
  Top Layer w0.254: R43.2 49.57,33.88 arc(50.48,33.5) 50.86,32.59 50.86,29.54
  Top Layer w0.762: 73.71,14.3 73.71,13.54 arc(73.49,13) 72.95,12.78 70.03,12.78 arc(69.31,13.08) 69.02,13.8 69.02,16.72 arc(68.69,17.5) 67.91,17.82 60.85,17.82 arc(59.01,17.99) 57.23,18.49 arc(52.58,22.18) 50.82,27.85 50.82,28.89 arc(50.59,29.44) D1.1
BOOT0: length 3.1
  Top Layer w0.254: U2.44 21.95,60.91 19.41,60.91 R28.1
BOOT1: length 4.9
  Top Layer w0.254: U2.20 34.98,62.42 R27.1
DC3SET: length 9.1
  Top Layer w0.254: 20.48,41.2 20.86,41.58 U3.28 ; 20.48,41.2 18.47,41.2 16.67,43.01 C59.1 arc(15.91,43.07) 15.93,43.15 R39.1 ; 20.48,41.2 U3.29
DCDC2_1V2: length 76.3
  Top Layer w0.254: 34.13,11.44 34.83,11.44 v3(35.01,11.62) ; 36.66,16.18 36.66,17.09 ; 33.84,43.74 33.77,43.67 ; 34.13,13.44 34.97,13.44 ; v1(35.11,21.41) 39.77,21.41 C25.1 40.7,20.49 40.7,18.37 40.26,17.94 40.26,17.09 ; U3.10 29.16,41.99 arc(29.49,42.05) 29.77,42.24 arc(30.48,42.71) 31.31,42.88 31.74,42.88 arc(32.28,42.84) 32.81,43 arc(33.19,43.29) 33.53,43.62
  Top Layer w0.508: v3(35.01,11.62) 35.09,11.7 35.09,15.74 35.52,16.18 36.66,16.18
  Top Layer w0.762: C48.1 C46.1 33.81,43.44 L2.2
  Bottom Layer w0.254: v1(34.84,43.77) v1(34.84,42.98) v1(33.82,42.98) v1(32.81,42.98)
  Bottom Layer w0.762: v2(39.81,8.18) v2(37.66,8.18) v2(35.67,8.18) 35.11,8.75 v1(35.11,15.83) v1(35.11,21.41) 31.69,24.83 31.69,42.51 32.92,43.74 34.84,43.74
  vias: v1(32.82,43.77) v1(33.83,43.77)
DCDC3_3V3: length 191.4
  Top Layer w0.152: v1(32.26,18.11) 32.13,17.99 29.4,17.99 R13.2
  Top Layer w0.229: U3.17 25.18,43.8 arc(25.08,44.26) 24.82,44.66 23.91,45.57 arc(23.64,45.96) 23.55,46.43 23.55,47.5 arc(23.56,47.66) 23.59,47.82 arc(23.71,48.1) L3.2
  Top Layer w0.254: 28.11,18.05 28.06,18.1 27.61,18.1 ; Q2.1 27.61,18.1 ; 27.61,18.1 28.51,17.19 R13.2 ; 41.03,11.84 40.22,11.84 ; v1(29.81,23.16) 29.57,22.92 R30.1 23.12,22.92 21.55,24.49 13.12,24.49 arc(12.31,24.65) 11.63,25.11 10.57,26.17 R14.2 R12.2 R11.2 R10.2 R9.2 R7.2 R6.2 R4.2 ; v1(80.03,2.09) 80.06,2.07 80.65,2.07 ; 38.66,17.09 38.67,17.08 38.67,16.21 ; 41.03,12.24 40.23,12.24 40.21,12.22
  Top Layer w0.508: 38.67,16.21 39.83,16.21 40.21,15.83 40.21,11.39 39.76,10.94 34.66,10.94 arc(34.61,10.94) 34.56,10.93 34.56,10.93 arc(34.54,10.93) 34.52,10.93 33.38,10.93 arc(33.32,10.93) 33.27,10.94 32.76,10.94 arc(32.36,10.78) 32.19,10.37 32.19,7.15 arc(32.16,7.1) C27.1 ; 48.06,12.05 40.23,12.05
  Top Layer w0.762: C52.1 24.06,50.94 C51.1 24.03,48.47 L3.2
  Bottom Layer w0.254: 29.77,26.17 29.81,26.13
  Bottom Layer w0.762: v1(23.55,48.59) 23.55,48.21 28.92,48.21 29.81,47.32 v1(29.81,23.16) 32.29,20.68 32.29,3.25 arc(33.04,1.46) 34.83,0.71 79.05,0.71 arc(79.72,0.99) 80,1.67 80,11.2 arc(80.58,12.59) v1(81.96,13.16) v1(82.65,13.16) v1(83.37,13.16)
  vias: v1(23.52,47.96) v1(24.41,48.59) v1(24.41,47.96) v1(32.29,9.09) v1(32.29,8.09) v1(32.28,7.06)
DDCSCL: length 15.6
  Top Layer w0.152: v1(29,20.12) 36,20.12 37.46,18.66 37.46,17.09
  Top Layer w0.254: R25.2 27.11,20.91 27.89,20.12 v1(29,20.12)
  Bottom Layer w0.254: v1(30.25,18.95) 30.25,19.67 29.77,20.15 29.02,20.15 v1(29,20.12)
DDCSDA: length 18.7
  Top Layer w0.152: 37.06,17.09 37.06,18.7 36.12,19.64 29.09,19.64 28.83,19.37 27.24,19.37 26.62,20 Q2.2
  Top Layer w0.254: R29.2 22.38,20.02 25.49,20.02 Q2.2 25.7,20.18 R30.2
DP_AUX_N: length 16.6
  Top Layer w0.154: v1(81.78,3.33) 81.62,3.33 arc(81.39,3.28) 81.2,3.15 80.09,3.15 arc(79.94,3.18) 79.81,3.27 arc(79.69,3.35) 79.54,3.38 C1.1 ; FPC1.16 84.4,13.68 arc(84.41,13.62) 84.44,13.57 arc(84.48,13.51) 84.49,13.45 84.49,13.04 arc(84.36,12.85) 84.32,12.62 v1(84.32,12.46)
  Bottom Layer w0.154: v1(81.78,3.33) 82.07,3.33 arc(82.18,3.31) 82.28,3.24 arc(82.37,3.18) 82.49,3.15 82.74,3.15 arc(83.98,3.67) 84.49,4.9 84.49,11.02 arc(84.46,11.1) 84.38,11.13 84.26,11.13 arc(84.17,11.17) 84.13,11.25 84.13,11.38 arc(84.17,11.47) 84.26,11.51 84.29,11.51 arc(84.43,11.57) 84.49,11.71 84.49,11.75 arc(84.47,11.87) 84.4,11.96 arc(84.34,12.06) 84.32,12.17 v1(84.32,12.46)
DP_AUX_P: length 16.6
  Top Layer w0.154: v1(81.78,2.67) 81.62,2.67 arc(81.39,2.72) 81.2,2.85 80.09,2.85 arc(79.94,2.82) 79.81,2.73 arc(79.69,2.65) 79.54,2.62 C3.1 ; v1(84.97,12.46) 84.97,12.62 arc(84.93,12.85) 84.8,13.04 84.8,13.45 arc(84.81,13.51) 84.85,13.57 arc(84.88,13.62) 84.9,13.68 FPC1.15
  Bottom Layer w0.154: v1(84.97,12.46) 84.97,12.17 arc(84.95,12.06) 84.89,11.96 arc(84.82,11.87) 84.8,11.75 84.8,4.78 arc(84.8,4.78) 84.8,4.78 arc(84.15,3.4) 82.74,2.85 82.49,2.85 arc(82.37,2.82) 82.28,2.76 arc(82.18,2.69) 82.07,2.67 v1(81.78,2.67)
DP_LANE0_N: length 10.7
  Top Layer w0.154: NOREF#64.1 86.4,13.42 arc(86.38,13.36) 86.35,13.31 arc(86.31,13.25) 86.3,13.19 86.3,11.43 arc(85.92,10.52) 85.02,10.15 80.21,10.15 arc(80.07,10.12) 79.94,10.04 arc(79.81,9.95) 79.67,9.92 C7.1
DP_LANE0_P: length 10.7
  Top Layer w0.154: C9.1 79.67,10.68 arc(79.81,10.65) 79.94,10.57 arc(80.07,10.49) 80.21,10.46 80.74,10.46 arc(80.89,10.52) 80.96,10.67 arc(81.02,10.82) 81.17,10.88 81.25,10.88 arc(81.4,10.82) 81.46,10.67 arc(81.53,10.52) 81.68,10.46 85.02,10.46 arc(85.71,10.74) 85.99,11.43 85.99,13.19 arc(85.98,13.25) 85.94,13.31 arc(85.91,13.36) 85.9,13.42 NOREF#28.1
DP_LANE1_N: length 11.5
  Top Layer w0.154: NOREF#43.1 87.9,13.42 arc(87.88,13.36) 87.85,13.31 arc(87.81,13.25) 87.8,13.19 87.8,9.63 arc(87.47,8.83) 86.67,8.5 82.63,8.5 arc(82.48,8.47) 82.35,8.38 arc(82.23,8.3) 82.08,8.27 C11.1
DP_LANE1_P: length 11.5
  Top Layer w0.154: C13.1 82.08,9.03 arc(82.23,9) 82.35,8.92 arc(82.48,8.83) 82.63,8.81 83.39,8.81 arc(83.53,8.87) 83.6,9.02 arc(83.66,9.17) 83.81,9.23 83.89,9.23 arc(84.04,9.17) 84.1,9.02 arc(84.17,8.87) 84.32,8.81 86.67,8.81 arc(87.25,9.05) 87.49,9.63 87.49,13.19 arc(87.48,13.25) 87.44,13.31 arc(87.41,13.36) 87.4,13.42 NOREF#42.1
DP_LANE2_N: length 16.2
  Top Layer w0.154: NOREF#84.1 89.4,13.42 arc(89.38,13.36) 89.35,13.31 arc(89.31,13.25) 89.3,13.19 89.3,9.61 arc(88.56,7.84) 86.79,7.1 80.21,7.1 arc(80.07,7.07) 79.94,6.99 arc(79.81,6.9) 79.67,6.87 C15.1
DP_LANE2_P: length 16.2
  Top Layer w0.154: NOREF#47.1 88.9,13.42 arc(88.91,13.36) 88.94,13.31 arc(88.98,13.25) 88.99,13.19 88.99,9.61 arc(88.35,8.05) 86.79,7.41 83.21,7.41 arc(83.06,7.47) 83,7.62 arc(82.94,7.77) 82.79,7.83 82.7,7.83 arc(82.55,7.77) 82.49,7.62 arc(82.43,7.47) 82.28,7.41 80.21,7.41 arc(80.07,7.44) 79.94,7.52 arc(79.81,7.61) 79.67,7.64 C17.1
DP_LANE3_N: length 16.8
  Top Layer w0.154: NOREF#37.1 90.9,13.42 arc(90.88,13.36) 90.85,13.31 arc(90.81,13.25) 90.8,13.19 90.8,8.12 arc(90.06,6.32) 88.26,5.58 82.63,5.58 arc(82.48,5.55) 82.35,5.46 arc(82.23,5.38) 82.08,5.35 C19.1
DP_LANE3_P: length 16.8
  Top Layer w0.154: C20.1 82.08,6.11 arc(82.23,6.08) 82.35,6 arc(82.48,5.91) 82.63,5.88 83.29,5.88 arc(83.43,5.95) 83.5,6.09 arc(83.56,6.24) 83.71,6.31 83.79,6.31 arc(83.94,6.24) 84,6.09 arc(84.07,5.95) 84.21,5.88 88.26,5.88 arc(89.84,6.54) 90.49,8.12 90.49,13.19 arc(90.48,13.25) 90.44,13.31 arc(90.41,13.36) 90.4,13.42 NOREF#8.1
DPO0_N: length 48.7
  Top Layer w0.154: C7.2 77.8,9.92 arc(77.65,9.95) 77.52,10.04 arc(77.4,10.12) 77.25,10.15 76.43,10.15 arc(76.08,10.3) 75.94,10.65 75.94,10.84 arc(75.75,11.03) 75.56,10.84 75.56,10.65 arc(75.06,10.15) 74.56,10.65 74.56,10.84 arc(74.37,11.03) 74.18,10.84 74.18,10.65 arc(73.68,10.15) 73.19,10.65 73.19,10.84 arc(73,11.03) 72.81,10.84 72.81,10.65 arc(72.31,10.15) 71.81,10.65 71.81,10.84 arc(71.62,11.03) 71.43,10.84 71.43,10.65 arc(70.93,10.15) 70.44,10.65 70.44,10.84 arc(70.25,11.03) 70.05,10.84 70.05,10.65 arc(69.56,10.15) 69.06,10.65 69.06,10.84 arc(68.87,11.03) 68.68,10.84 68.68,10.65 arc(68.18,10.15) 67.68,10.65 67.68,10.84 arc(67.49,11.03) 67.3,10.84 67.3,10.65 arc(66.81,10.15) 66.31,10.65 66.31,10.84 arc(66.12,11.03) 65.93,10.84 65.93,10.65 arc(65.78,10.29) 65.43,10.15 64.9,10.15 arc(63.93,10.34) 63.1,10.89 58.76,15.23 arc(58.04,15.71) 57.19,15.88 41.67,15.88 41.62,15.84 U1.41
